# Altium project APE - Single Board Computer.PrjPcb (part 3 of 3)

## Sheet 13_Wireless.SchDoc
size 812 x 508 mm; SheetNumber: 13; SheetTotal: 16
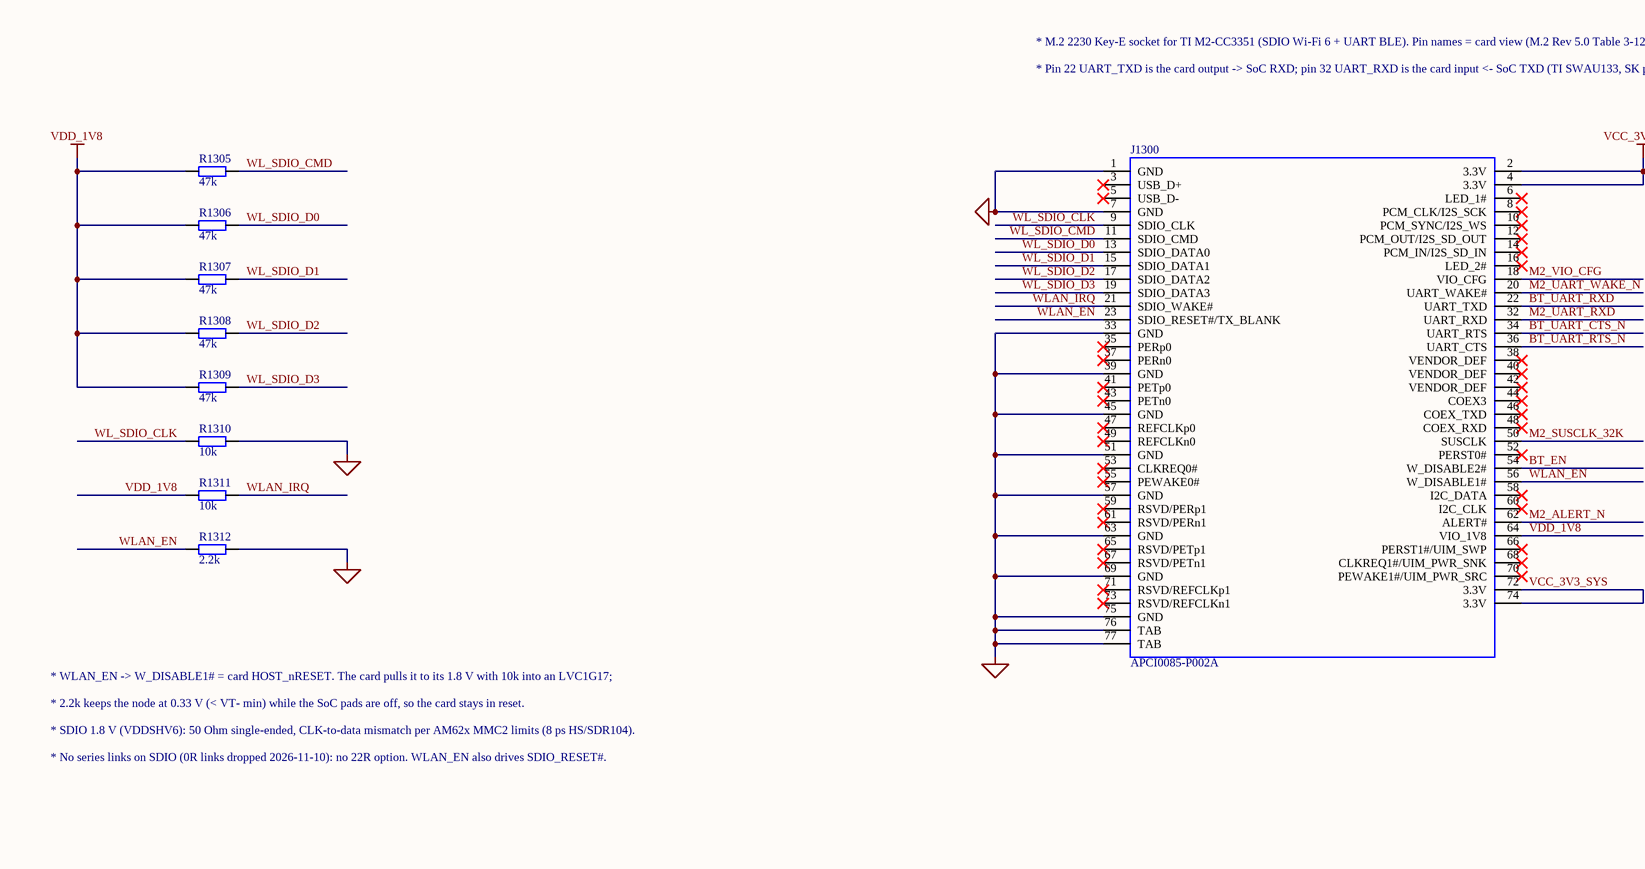
[diagram p17: 13_Wireless.SchDoc, left]
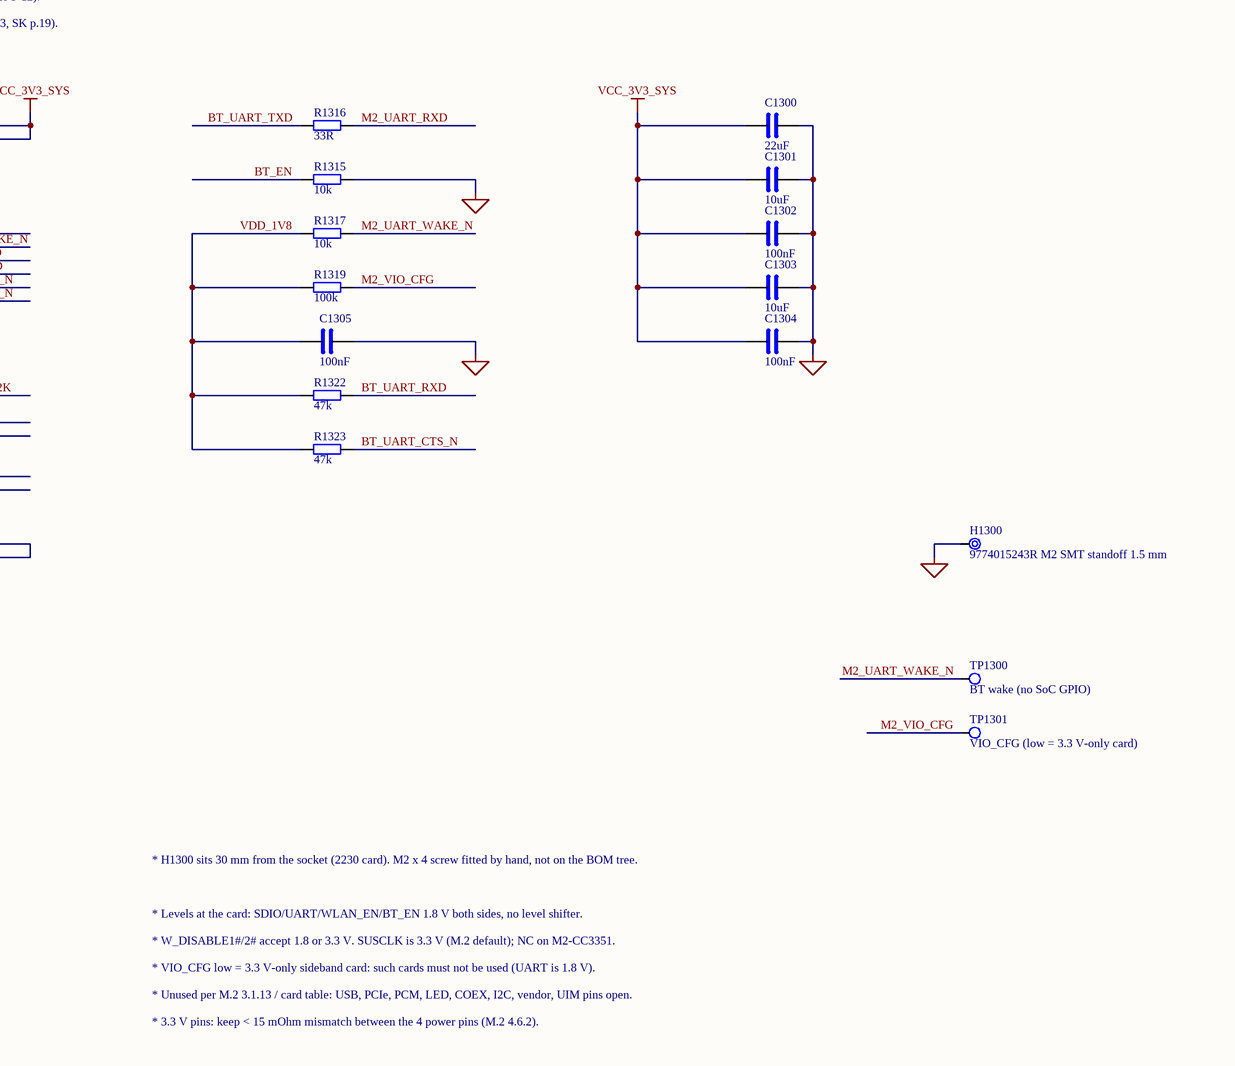
[diagram p18: 13_Wireless.SchDoc, right]

### Parts
C1300  22uF  [C0805]
C1301  10uF  [C0603]
C1302  100nF  [C0402]
C1303  10uF  [C0603]
C1304  100nF  [C0402]
C1305  100nF  [C0402]
H1300  9774015243R M2 SMT standoff 1.5 mm  [STANDOFF_WE_9774015243R]
J1300  APCI0085-P002A  [M2_KEYE_APCI0085]
R1305  47k  [R0402]
R1306  47k  [R0402]
R1307  47k  [R0402]
R1308  47k  [R0402]
R1309  47k  [R0402]
R1310  10k  [R0402]
R1311  10k  [R0402]
R1312  2.2k  [R0402]
R1315  10k  [R0402]
R1316  33R  [R0402]
R1317  10k  [R0402]
R1319  100k  [R0402]
R1322  47k  [R0402]
R1323  47k  [R0402]
TP1300  BT wake (no SoC GPIO)  [TP_PAD_1.0]
TP1301  VIO_CFG (low = 3.3 V-only card)  [TP_PAD_1.0]

### Nets
GND: C1300.2 C1301.2 C1302.2 C1303.2 C1304.2 C1305.2 H1300.1(MH) J1300.1(GND) J1300.7(GND) J1300.33(GND) J1300.39(GND) J1300.45(GND) J1300.51(GND) J1300.57(GND) J1300.63(GND) J1300.69(GND) J1300.75(GND) J1300.76(TAB) J1300.77(TAB) R1310.2 R1312.2 R1315.2
VCC_3V3_SYS: C1300.1 C1301.1 C1302.1 C1303.1 C1304.1 J1300.2(3.3V) J1300.4(3.3V) J1300.72(3.3V) J1300.74(3.3V)
VDD_1V8: C1305.1 J1300.64(VIO_1V8) R1305.1 R1306.1 R1307.1 R1308.1 R1309.1 R1311.1 R1317.1 R1319.1 R1322.1 R1323.1
BT_EN: J1300.54(W_DISABLE2#) R1315.1
BT_UART_CTS_N: J1300.34(UART_RTS) R1323.2
BT_UART_RTS_N: J1300.36(UART_CTS)
BT_UART_RXD: J1300.22(UART_TXD) R1322.2
BT_UART_TXD: R1316.1
M2_ALERT_N: J1300.62(ALERT#)
M2_SUSCLK_32K: J1300.50(SUSCLK)
M2_UART_RXD: J1300.32(UART_RXD) R1316.2
M2_UART_WAKE_N: J1300.20(UART_WAKE#) R1317.2 TP1300.1(TP)
M2_VIO_CFG: J1300.18(VIO_CFG) R1319.2 TP1301.1(TP)
WL_SDIO_CLK: J1300.9(SDIO_CLK) R1310.1
WL_SDIO_CMD: J1300.11(SDIO_CMD) R1305.2
WL_SDIO_D0: J1300.13(SDIO_DATA0) R1306.2
WL_SDIO_D1: J1300.15(SDIO_DATA1) R1307.2
WL_SDIO_D2: J1300.17(SDIO_DATA2) R1308.2
WL_SDIO_D3: J1300.19(SDIO_DATA3) R1309.2
WLAN_EN: J1300.23(SDIO_RESET#/TX_BLANK) J1300.56(W_DISABLE1#) R1312.1
WLAN_IRQ: J1300.21(SDIO_WAKE#) R1311.2

Not connected (* = marked no-connect by the designer): J1300 3(USB_D+)* 5(USB_D-)* 6(LED_1#)* 8(PCM_CLK/I2S_SCK)* 10(PCM_SYNC/I2S_WS)* 12(PCM_OUT/I2S_SD_OUT)* 14(PCM_IN/I2S_SD_IN)* 16(LED_2#)* 35(PERp0)* 37(PERn0)* 38(VENDOR_DEF)* 40(VENDOR_DEF)* 41(PETp0)* 42(VENDOR_DEF)* 43(PETn0)* 44(COEX3)* 46(COEX_TXD)* 47(REFCLKp0)* 48(COEX_RXD)* 49(REFCLKn0)* 52(PERST0#)* 53(CLKREQ0#)* 55(PEWAKE0#)* 58(I2C_DATA)* 59(RSVD/PERp1)* 60(I2C_CLK)* 61(RSVD/PERn1)* 65(RSVD/PETp1)* 66(PERST1#/UIM_SWP)* 67(RSVD/PETn1)* 68(CLKREQ1#/UIM_PWR_SNK)* 70(PEWAKE1#/UIM_PWR_SRC)* 71(RSVD/REFCLKp1)* 73(RSVD/REFCLKn1)*

### Notes on the sheet
- * M.2 2230 Key-E socket for TI M2-CC3351 (SDIO Wi-Fi 6 + UART BLE). Pin names = card view (M.2 Rev 5.0 Table 3-12).
- * Pin 22 UART_TXD is the card output -> SoC RXD; pin 32 UART_RXD is the card input <- SoC TXD (TI SWAU133, SK p.19).
- * WLAN_EN -> W_DISABLE1# = card HOST_nRESET. The card pulls it to its 1.8 V with 10k into an LVC1G17;
- * 2.2k keeps the node at 0.33 V (< VT- min) while the SoC pads are off, so the card stays in reset.
- * SDIO 1.8 V (VDDSHV6): 50 Ohm single-ended, CLK-to-data mismatch per AM62x MMC2 limits (8 ps HS/SDR104).
- * No series links on SDIO (0R links dropped 2026-11-10): no 22R option. WLAN_EN also drives SDIO_RESET#.
- * H1300 sits 30 mm from the socket (2230 card). M2 x 4 screw fitted by hand, not on the BOM tree.
- * Levels at the card: SDIO/UART/WLAN_EN/BT_EN 1.8 V both sides, no level shifter.
- * W_DISABLE1#/2# accept 1.8 or 3.3 V. SUSCLK is 3.3 V (M.2 default); NC on M2-CC3351.
- * VIO_CFG low = 3.3 V-only sideband card: such cards must not be used (UART is 1.8 V).
- * Unused per M.2 3.1.13 / card table: USB, PCIe, PCM, LED, COEX, I2C, vendor, UIM pins open.
- * 3.3 V pins: keep < 15 mOhm mismatch between the 4 power pins (M.2 4.6.2).

### Library data of the parts
C1300 = CAP: Capacitor, non-polarized; MPN: CL21A226MAQNNNE; Manufacturer: Samsung; Spec: 22uF 25V X5R 0805 (bulk); LCSC: C45783
C1301 = CAP: Capacitor, non-polarized; Spec: 10uF 10V X5R 0603 (pins 2/4)
C1302 = CAP: Capacitor, non-polarized; MPN: CL05B104KO5NNNC; Manufacturer: Samsung; Spec: 100nF 16V X7R 0402 (pins 2/4); LCSC: C1525
C1303 = CAP: Capacitor, non-polarized; Spec: 10uF 10V X5R 0603 (pins 72/74)
C1304 = CAP: Capacitor, non-polarized; MPN: CL05B104KO5NNNC; Manufacturer: Samsung; Spec: 100nF 16V X7R 0402 (pins 72/74); LCSC: C1525
C1305 = CAP: Capacitor, non-polarized; MPN: CL05B104KO5NNNC; Manufacturer: Samsung; Spec: 100nF 16V X7R 0402 (pin 64); LCSC: C1525
H1300 = MOUNTING_HOLE: Plated mounting hole (pin to GND); Manufacturer: Wurth Elektronik; MPN: 9774015243R; LCSC: C22431324
J1300 = APCI0085-P002A: M.2 Key-E socket, 67 contacts 0.5 mm, H3.2, 2 SMT tabs (LOTES APCI0085-P002A); MPN: APCI0085-P002A; Manufacturer: LOTES; LCSC: C841649
R1305-R1309 = RES: Resistor; MPN: 0402WGF4702TCE; Manufacturer: UNI-ROYAL; Spec: 47k 0402 (SDIO pull-up); LCSC: C25792
R1310 = RES: Resistor; MPN: 0402WGF1002TCE; Manufacturer: UNI-ROYAL; Spec: 10k 0402 (SK R12, clock low while pad is off); LCSC: C25744
R1311 = RES: Resistor; MPN: 0402WGF1002TCE; Manufacturer: UNI-ROYAL; Spec: 10k 0402 (card IRQ is open drain, SK R6); LCSC: C25744
R1312 = RES: Resistor; Spec: 2.2k 0402 (beats the card's 10k pull-up: 0.33 V)
R1315 = RES: Resistor; MPN: 0402WGF1002TCE; Manufacturer: UNI-ROYAL; Spec: 10k 0402 (W_DISABLE2#: BT off by default); LCSC: C25744
R1316 = RES: Resistor; Spec: 33R 0402 (SK R24)
R1317 = RES: Resistor; MPN: 0402WGF1002TCE; Manufacturer: UNI-ROYAL; Spec: 10k 0402 (card IRQ_BLE open drain); LCSC: C25744
R1319 = RES: Resistor; Spec: 100k 0402 (VIO_CFG weak pull-up, M.2 3.1.15)
R1322 = RES: Resistor; MPN: 0402WGF4702TCE; Manufacturer: UNI-ROYAL; Spec: 47k 0402 (UART6 RXD pull-up, 62_UART_2); LCSC: C25792
R1323 = RES: Resistor; MPN: 0402WGF4702TCE; Manufacturer: UNI-ROYAL; Spec: 47k 0402 (UART6 CTSn pull-up); LCSC: C25792
TP1300 TP1301 = TESTPOINT: Test point

## Sheet 14_Expansion.SchDoc
size 812 x 508 mm; SheetNumber: 14; SheetTotal: 16
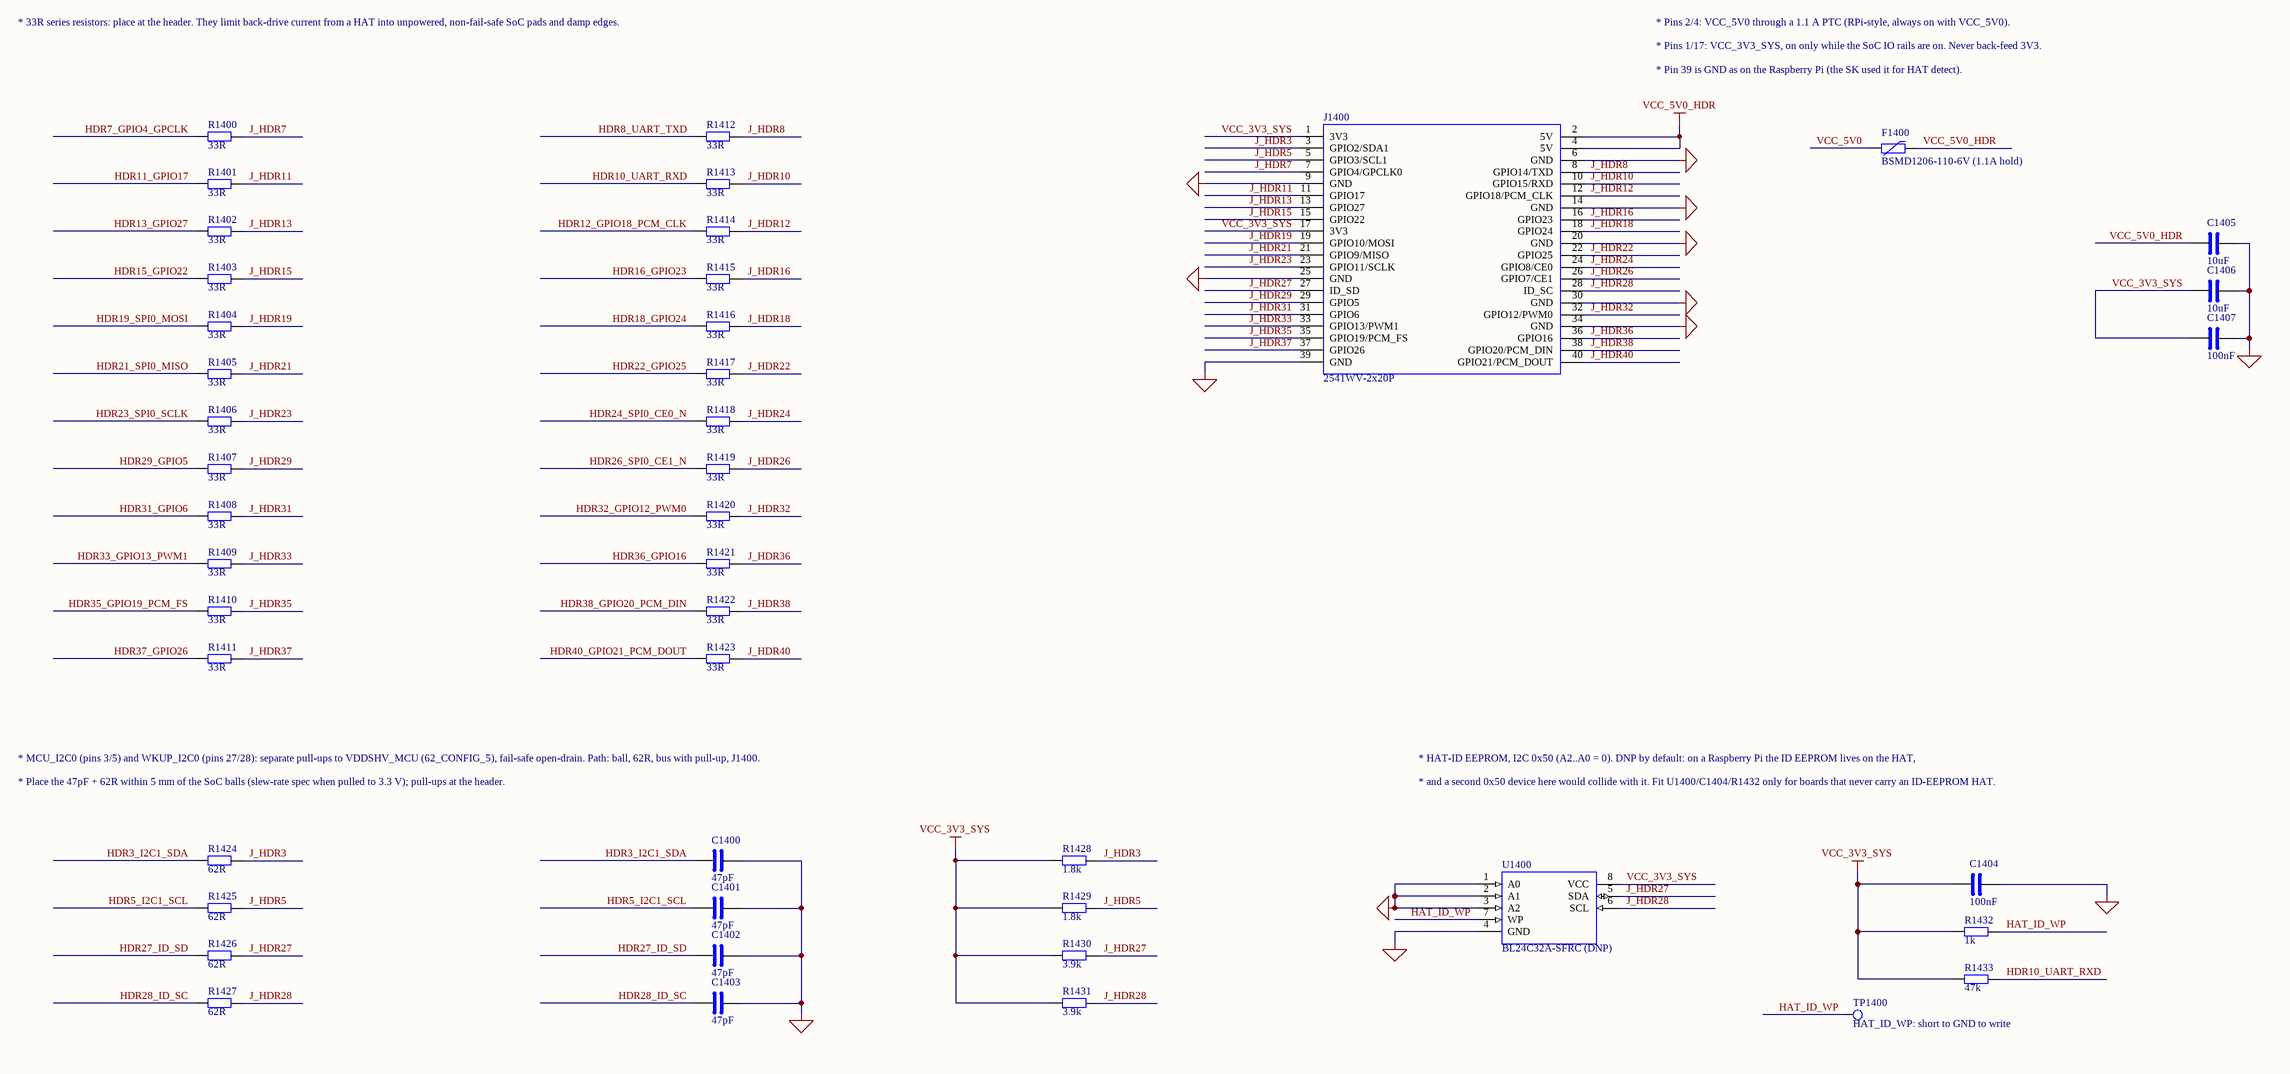
[diagram p19: 14_Expansion.SchDoc]

### Parts
C1400  47pF  [C0402]
C1401  47pF  [C0402]
C1402  47pF  [C0402]
C1403  47pF  [C0402]
C1404  100nF  [C0402]
C1405  10uF  [C0603]
C1406  10uF  [C0603]
C1407  100nF  [C0402]
F1400  BSMD1206-110-6V (1.1A hold)  [FUSE_BHFUSE_BSMD1206]
J1400  2541WV-2x20P  [HDR_2X20_P2.54_THT]
R1400  33R  [R0402]
R1401  33R  [R0402]
R1402  33R  [R0402]
R1403  33R  [R0402]
R1404  33R  [R0402]
R1405  33R  [R0402]
R1406  33R  [R0402]
R1407  33R  [R0402]
R1408  33R  [R0402]
R1409  33R  [R0402]
R1410  33R  [R0402]
R1411  33R  [R0402]
R1412  33R  [R0402]
R1413  33R  [R0402]
R1414  33R  [R0402]
R1415  33R  [R0402]
R1416  33R  [R0402]
R1417  33R  [R0402]
R1418  33R  [R0402]
R1419  33R  [R0402]
R1420  33R  [R0402]
R1421  33R  [R0402]
R1422  33R  [R0402]
R1423  33R  [R0402]
R1424  62R  [R0402]
R1425  62R  [R0402]
R1426  62R  [R0402]
R1427  62R  [R0402]
R1428  1.8k  [R0402]
R1429  1.8k  [R0402]
R1430  3.9k  [R0402]
R1431  3.9k  [R0402]
R1432  1k  [R0402]
R1433  47k  [R0402]
TP1400  HAT_ID_WP: short to GND to write  [TP_PAD_1.0]
U1400  BL24C32A-SFRC (DNP)  [TSSOP8_4.4X3.0_P0.65]

### Nets
GND: C1400.2 C1401.2 C1402.2 C1403.2 C1404.2 C1405.2 C1406.2 C1407.2 J1400.6(GND) J1400.9(GND) J1400.14(GND) J1400.20(GND) J1400.25(GND) J1400.30(GND) J1400.34(GND) J1400.39(GND) U1400.1(A0) U1400.2(A1) U1400.3(A2) U1400.4(GND)
VCC_3V3_SYS: C1404.1 C1406.1 C1407.1 J1400.1(3V3) J1400.17(3V3) R1428.1 R1429.1 R1430.1 R1431.1 R1432.1 R1433.1 U1400.8(VCC)
VCC_5V0: F1400.1
VCC_5V0_HDR: C1405.1 F1400.2 J1400.2(5V) J1400.4(5V)
HAT_ID_WP: R1432.2 TP1400.1(TP) U1400.7(WP)
HDR3_I2C1_SDA: C1400.1 R1424.1
HDR5_I2C1_SCL: C1401.1 R1425.1
HDR7_GPIO4_GPCLK: R1400.1
HDR8_UART_TXD: R1412.1
HDR10_UART_RXD: R1413.1 R1433.2
HDR11_GPIO17: R1401.1
HDR12_GPIO18_PCM_CLK: R1414.1
HDR13_GPIO27: R1402.1
HDR15_GPIO22: R1403.1
HDR16_GPIO23: R1415.1
HDR18_GPIO24: R1416.1
HDR19_SPI0_MOSI: R1404.1
HDR21_SPI0_MISO: R1405.1
HDR22_GPIO25: R1417.1
HDR23_SPI0_SCLK: R1406.1
HDR24_SPI0_CE0_N: R1418.1
HDR26_SPI0_CE1_N: R1419.1
HDR27_ID_SD: C1402.1 R1426.1
HDR28_ID_SC: C1403.1 R1427.1
HDR29_GPIO5: R1407.1
HDR31_GPIO6: R1408.1
HDR32_GPIO12_PWM0: R1420.1
HDR33_GPIO13_PWM1: R1409.1
HDR35_GPIO19_PCM_FS: R1410.1
HDR36_GPIO16: R1421.1
HDR37_GPIO26: R1411.1
HDR38_GPIO20_PCM_DIN: R1422.1
HDR40_GPIO21_PCM_DOUT: R1423.1
J_HDR3: J1400.3(GPIO2/SDA1) R1424.2 R1428.2
J_HDR5: J1400.5(GPIO3/SCL1) R1425.2 R1429.2
J_HDR7: J1400.7(GPIO4/GPCLK0) R1400.2
J_HDR8: J1400.8(GPIO14/TXD) R1412.2
J_HDR10: J1400.10(GPIO15/RXD) R1413.2
J_HDR11: J1400.11(GPIO17) R1401.2
J_HDR12: J1400.12(GPIO18/PCM_CLK) R1414.2
J_HDR13: J1400.13(GPIO27) R1402.2
J_HDR15: J1400.15(GPIO22) R1403.2
J_HDR16: J1400.16(GPIO23) R1415.2
J_HDR18: J1400.18(GPIO24) R1416.2
J_HDR19: J1400.19(GPIO10/MOSI) R1404.2
J_HDR21: J1400.21(GPIO9/MISO) R1405.2
J_HDR22: J1400.22(GPIO25) R1417.2
J_HDR23: J1400.23(GPIO11/SCLK) R1406.2
J_HDR24: J1400.24(GPIO8/CE0) R1418.2
J_HDR26: J1400.26(GPIO7/CE1) R1419.2
J_HDR27: J1400.27(ID_SD) R1426.2 R1430.2 U1400.5(SDA)
J_HDR28: J1400.28(ID_SC) R1427.2 R1431.2 U1400.6(SCL)
J_HDR29: J1400.29(GPIO5) R1407.2
J_HDR31: J1400.31(GPIO6) R1408.2
J_HDR32: J1400.32(GPIO12/PWM0) R1420.2
J_HDR33: J1400.33(GPIO13/PWM1) R1409.2
J_HDR35: J1400.35(GPIO19/PCM_FS) R1410.2
J_HDR36: J1400.36(GPIO16) R1421.2
J_HDR37: J1400.37(GPIO26) R1411.2
J_HDR38: J1400.38(GPIO20/PCM_DIN) R1422.2
J_HDR40: J1400.40(GPIO21/PCM_DOUT) R1423.2

### Notes on the sheet
- * 33R series resistors: place at the header. They limit back-drive current from a HAT into unpowered, non-fail-safe SoC pads and damp edges.
- * Pins 2/4: VCC_5V0 through a 1.1 A PTC (RPi-style, always on with VCC_5V0).
- * Pins 1/17: VCC_3V3_SYS, on only while the SoC IO rails are on. Never back-feed 3V3.
- * Pin 39 is GND as on the Raspberry Pi (the SK used it for HAT detect).
- * MCU_I2C0 (pins 3/5) and WKUP_I2C0 (pins 27/28): separate pull-ups to VDDSHV_MCU (62_CONFIG_5), fail-safe open-drain. Path: ball, 62R, bus with pull-up, J1400.
- * HAT-ID EEPROM, I2C 0x50 (A2..A0 = 0). DNP by default: on a Raspberry Pi the ID EEPROM lives on the HAT,
- * Place the 47pF + 62R within 5 mm of the SoC balls (slew-rate spec when pulled to 3.3 V); pull-ups at the header.
- * and a second 0x50 device here would collide with it. Fit U1400/C1404/R1432 only for boards that never carry an ID-EEPROM HAT.

### Library data of the parts
C1400-C1403 = CAP: Capacitor, non-polarized; MPN: 0402CG470J500NT; Manufacturer: FH; Spec: 47pF 50V C0G 0402 (I2C slew limiter)
C1404 = CAP: Capacitor, non-polarized; DNP: 1; Spec: 100nF 16V X7R 0402 (EEPROM, DNP)
C1405 = CAP: Capacitor, non-polarized; Spec: 10uF 10V X5R 0603 (header 5V)
C1406 = CAP: Capacitor, non-polarized; Spec: 10uF 10V X5R 0603 (header 3V3)
C1407 = CAP: Capacitor, non-polarized; Spec: 100nF 16V X7R 0402 (header 3V3)
F1400 = PTC_BSMD1206: PTC resettable fuse, 1206, not polarized; Manufacturer: BHFUSE; MPN: BSMD1206-110-6V
J1400 = HDR_2X20_2541WV: Pin header 2x20 2.54 mm, Raspberry Pi 40-pin numbering; Manufacturer: HanElectricity; MPN: 2541WV-2x20P
R1400-R1423 = RES: Resistor; MPN: 0402WGF330JTCE; Manufacturer: UNI-ROYAL; Spec: 33R 1% 0402
R1424-R1427 = RES: Resistor; MPN: 0402WGF620JTCE; Manufacturer: UNI-ROYAL; Spec: 62R 1% 0402 (slew limiter)
R1428 R1429 = RES: Resistor; Spec: 1.8k 1% 0402 (RPi I2C1 value)
R1430 R1431 = RES: Resistor; Spec: 3.9k 1% 0402 (HAT ID bus)
R1432 = RES: Resistor; DNP: 1; Spec: 1k 1% 0402 (WP pull-up, DNP)
R1433 = RES: Resistor; Spec: 47k 1% 0402 (UART5 RX idle high, Octavo 62_UART_2)
TP1400 = TESTPOINT: Test point
U1400 = BL24C32A_TSSOP8: BL24C32A 32 Kbit I2C EEPROM (2-byte address), TSSOP-8; Manufacturer: Shanghai Belling; DNP: 1; MPN: BL24C32A-SFRC

## Sheet 15_Debug.SchDoc
size 812 x 508 mm; SheetNumber: 15; SheetTotal: 16
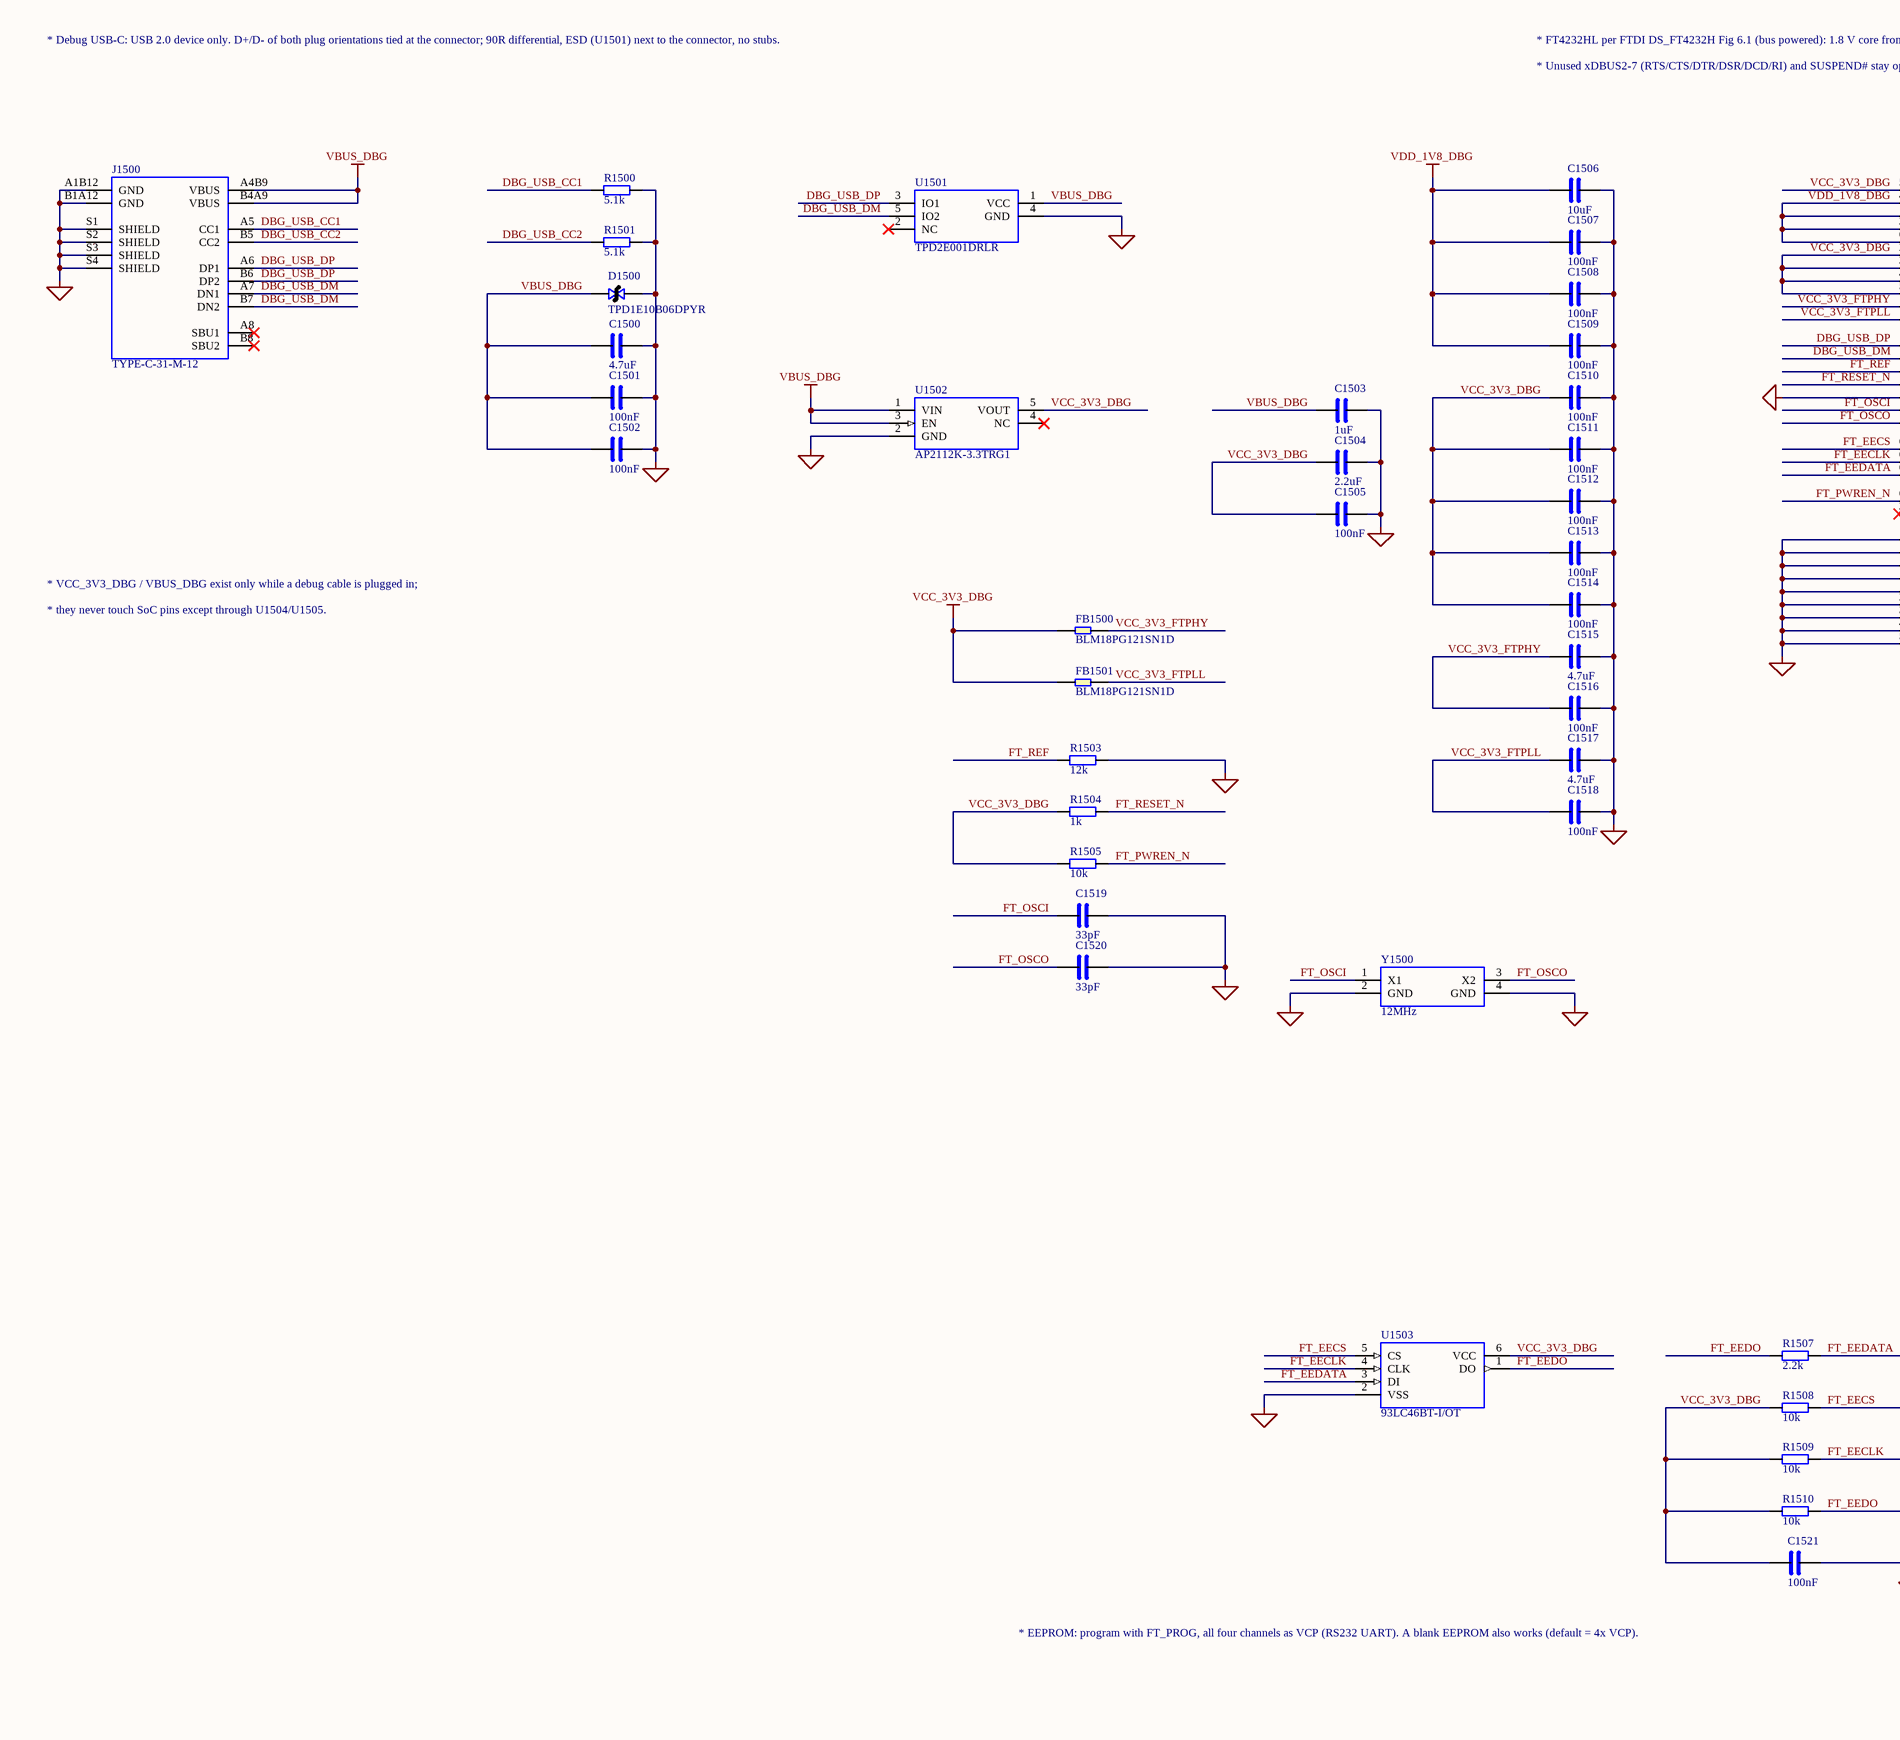
[diagram p20: 15_Debug.SchDoc, left]
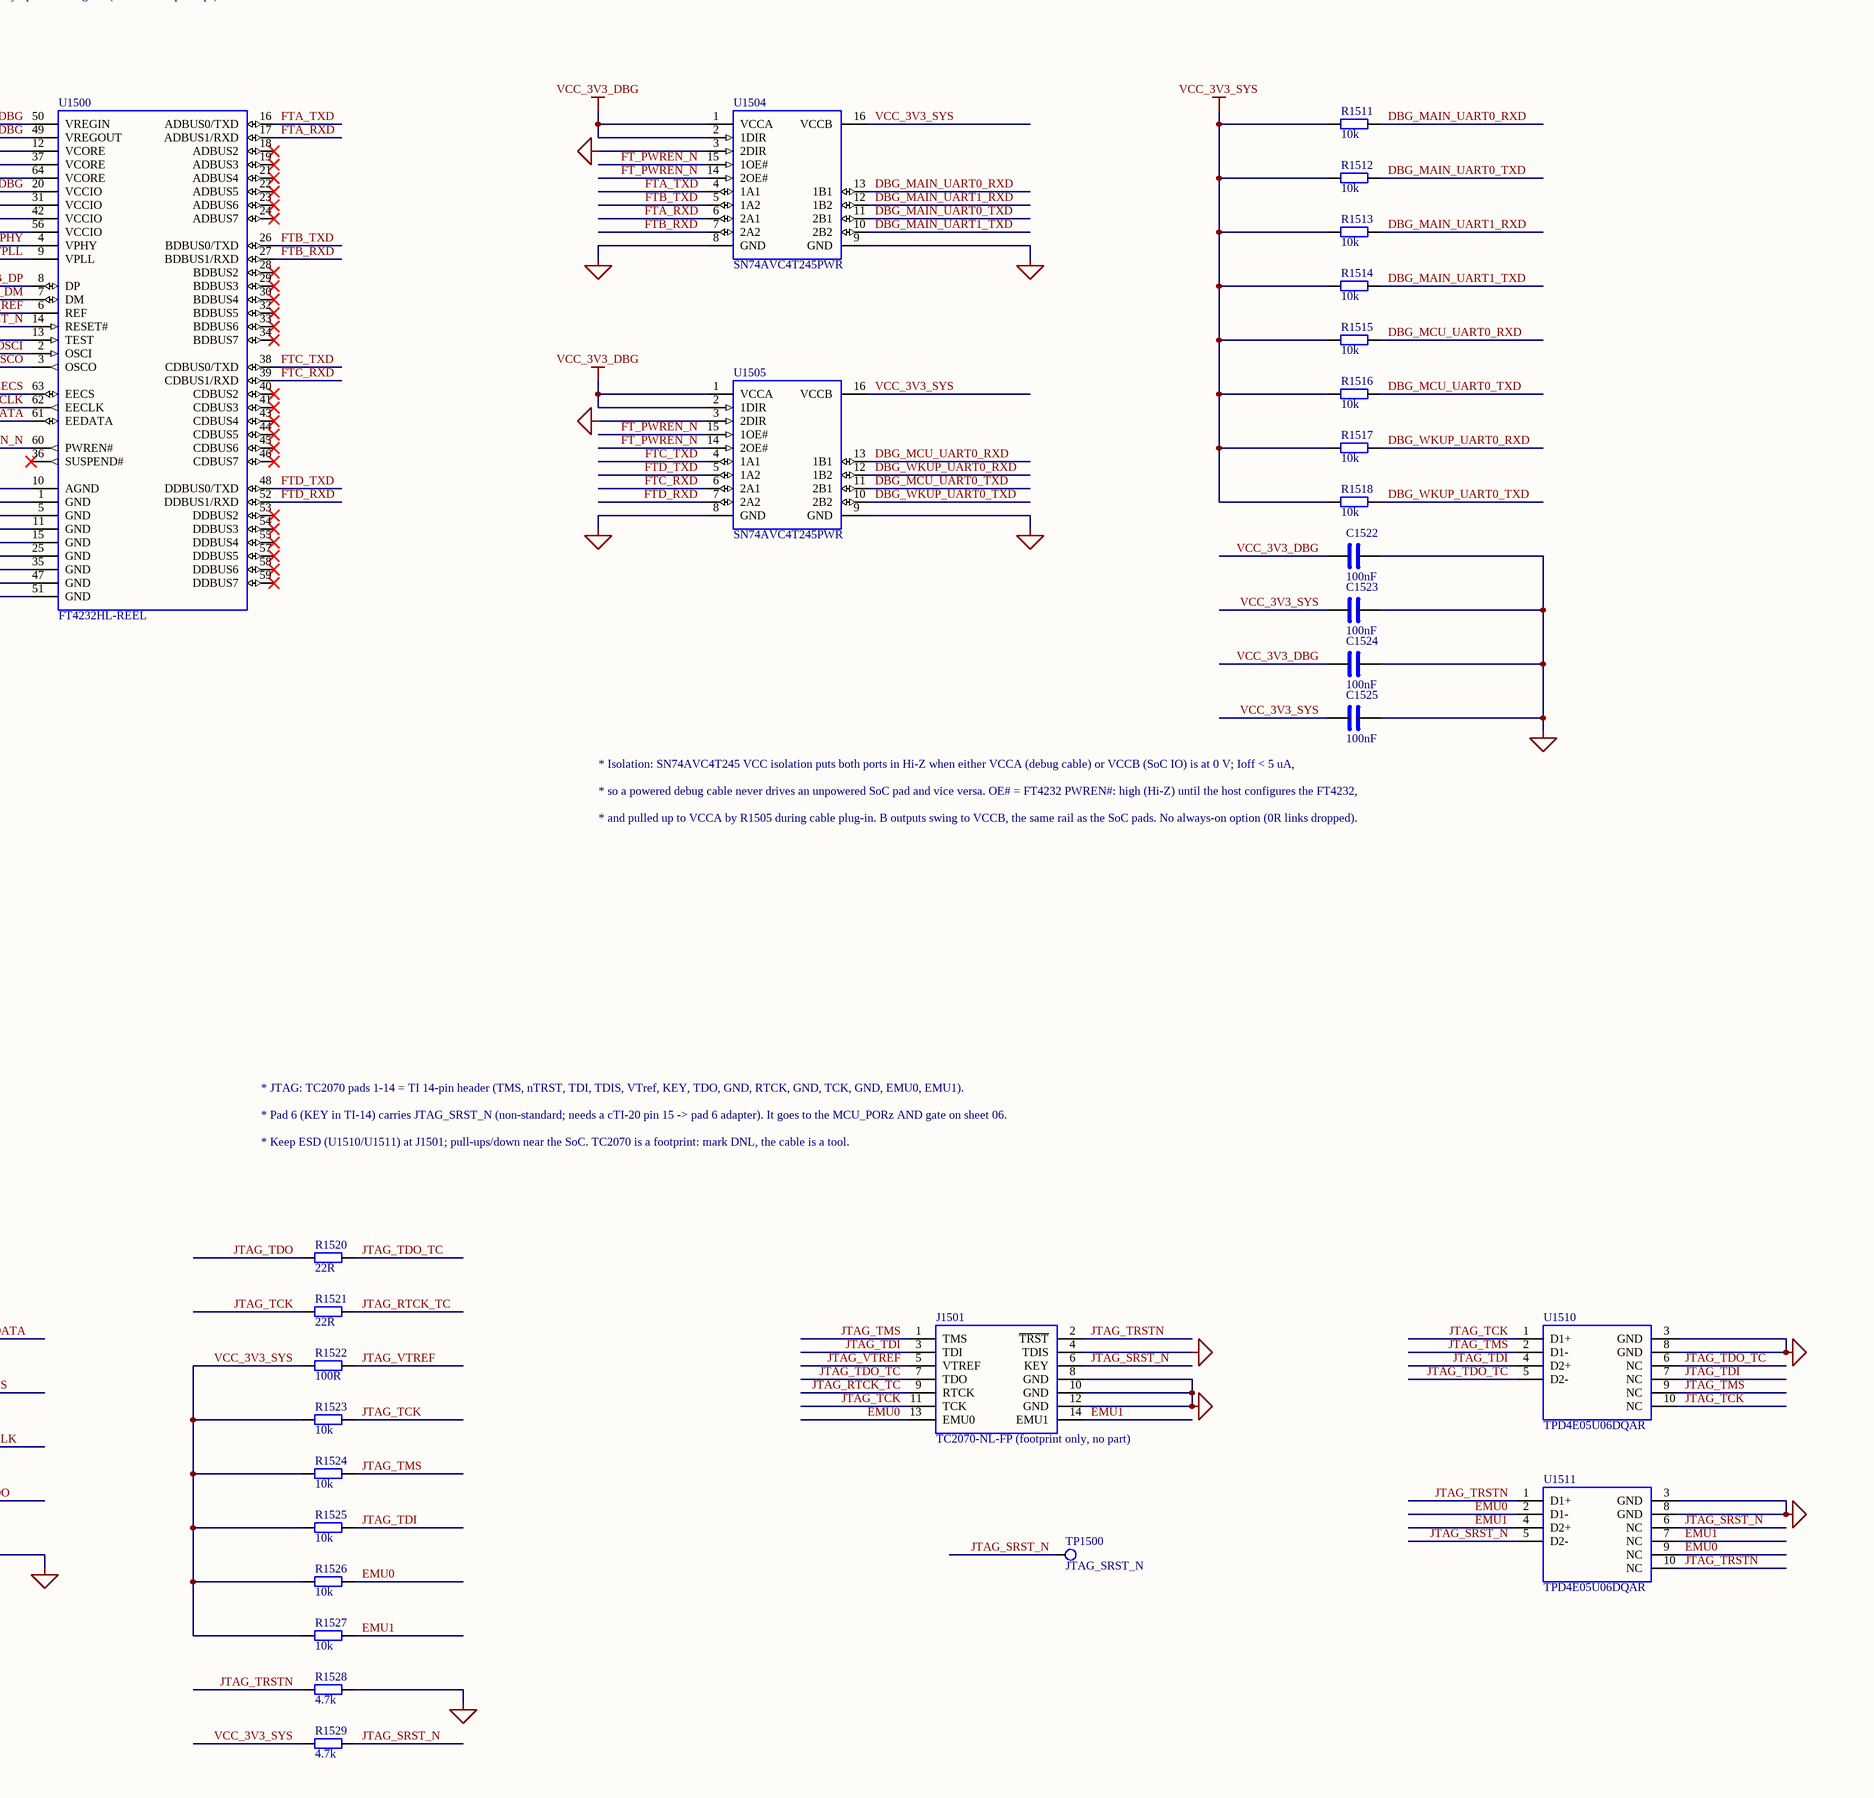
[diagram p21: 15_Debug.SchDoc, right]

### Parts
C1500  4.7uF  [C0603]
C1501  100nF  [C0402]
C1502  100nF  [C0402]
C1503  1uF  [C0402]
C1504  2.2uF  [C0402]
C1505  100nF  [C0402]
C1506  10uF  [C0603]
C1507  100nF  [C0402]
C1508  100nF  [C0402]
C1509  100nF  [C0402]
C1510  100nF  [C0402]
C1511  100nF  [C0402]
C1512  100nF  [C0402]
C1513  100nF  [C0402]
C1514  100nF  [C0402]
C1515  4.7uF  [C0402]
C1516  100nF  [C0402]
C1517  4.7uF  [C0402]
C1518  100nF  [C0402]
C1519  33pF  [C0402]
C1520  33pF  [C0402]
C1521  100nF  [C0402]
C1522  100nF  [C0402]
C1523  100nF  [C0402]
C1524  100nF  [C0402]
C1525  100nF  [C0402]
D1500  TPD1E10B06DPYR  [X1SON2_DPY]
FB1500  BLM18PG121SN1D  [FB0603]
FB1501  BLM18PG121SN1D  [FB0603]
J1500  TYPE-C-31-M-12  [USB-C_HRO_TYPE-C-31-M-12]
J1501  TC2070-NL-FP (footprint only, no part)  [TC2070-NL]
R1500  5.1k  [R0402]
R1501  5.1k  [R0402]
R1503  12k  [R0402]
R1504  1k  [R0402]
R1505  10k  [R0402]
R1507  2.2k  [R0402]
R1508  10k  [R0402]
R1509  10k  [R0402]
R1510  10k  [R0402]
R1511  10k  [R0402]
R1512  10k  [R0402]
R1513  10k  [R0402]
R1514  10k  [R0402]
R1515  10k  [R0402]
R1516  10k  [R0402]
R1517  10k  [R0402]
R1518  10k  [R0402]
R1520  22R  [R0402]
R1521  22R  [R0402]
R1522  100R  [R0402]
R1523  10k  [R0402]
R1524  10k  [R0402]
R1525  10k  [R0402]
R1526  10k  [R0402]
R1527  10k  [R0402]
R1528  4.7k  [R0402]
R1529  4.7k  [R0402]
TP1500  JTAG_SRST_N  [TP_PAD_1.0]
U1500  FT4232HL-REEL  [LQFP64_10X10_P0.5]
U1501  TPD2E001DRLR  [SOT553-5]
U1502  AP2112K-3.3TRG1  [SOT23-5]
U1503  93LC46BT-I/OT  [SOT23-6]
U1504  SN74AVC4T245PWR  [TSSOP16_4.4X5.0_P0.65]
U1505  SN74AVC4T245PWR  [TSSOP16_4.4X5.0_P0.65]
U1510  TPD4E05U06DQAR  [USON10_DQA]
U1511  TPD4E05U06DQAR  [USON10_DQA]
Y1500  12MHz  [XTAL_3225_4P]

### Nets
GND: C1500.2 C1501.2 C1502.2 C1503.2 C1504.2 C1505.2 C1506.2 C1507.2 C1508.2 C1509.2 C1510.2 C1511.2 C1512.2 C1513.2 C1514.2 C1515.2 C1516.2 C1517.2 C1518.2 C1519.2 C1520.2 C1521.2 C1522.2 C1523.2 C1524.2 C1525.2 D1500.2 J1500.A1B12(GND) J1500.B1A12(GND) J1500.S1(SHIELD) J1500.S2(SHIELD) J1500.S3(SHIELD) J1500.S4(SHIELD) J1501.4(TDIS) J1501.8(GND) J1501.10(GND) J1501.12(GND) R1500.2 R1501.2 R1503.2 R1528.2 U1500.1(GND) U1500.5(GND) U1500.10(AGND) U1500.11(GND) U1500.13(TEST) U1500.15(GND) U1500.25(GND) U1500.35(GND) U1500.47(GND) U1500.51(GND) U1501.4(GND) U1502.2(GND) U1503.2(VSS) U1504.3(2DIR) U1504.8(GND) U1504.9(GND) U1505.3(2DIR) U1505.8(GND) U1505.9(GND) U1510.3(GND) U1510.8(GND) U1511.3(GND) U1511.8(GND) Y1500.2(GND) Y1500.4(GND)
VBUS_DBG: C1500.1 C1501.1 C1502.1 C1503.1 D1500.1 J1500.A4B9(VBUS) J1500.B4A9(VBUS) U1501.1(VCC) U1502.1(VIN) U1502.3(EN)
VCC_3V3_DBG: C1504.1 C1505.1 C1510.1 C1511.1 C1512.1 C1513.1 C1514.1 C1521.1 C1522.1 C1524.1 FB1500.1 FB1501.1 R1504.1 R1505.1 R1508.1 R1509.1 R1510.1 U1500.20(VCCIO) U1500.31(VCCIO) U1500.42(VCCIO) U1500.50(VREGIN) U1500.56(VCCIO) U1502.5(VOUT) U1503.6(VCC) U1504.1(VCCA) U1504.2(1DIR) U1505.1(VCCA) U1505.2(1DIR)
VCC_3V3_SYS: C1523.1 C1525.1 R1511.1 R1512.1 R1513.1 R1514.1 R1515.1 R1516.1 R1517.1 R1518.1 R1522.1 R1523.1 R1524.1 R1525.1 R1526.1 R1527.1 R1529.1 U1504.16(VCCB) U1505.16(VCCB)
VDD_1V8_DBG: C1506.1 C1507.1 C1508.1 C1509.1 U1500.12(VCORE) U1500.37(VCORE) U1500.49(VREGOUT) U1500.64(VCORE)
DBG_MAIN_UART0_RXD: R1511.2 U1504.13(1B1)
DBG_MAIN_UART0_TXD: R1512.2 U1504.11(2B1)
DBG_MAIN_UART1_RXD: R1513.2 U1504.12(1B2)
DBG_MAIN_UART1_TXD: R1514.2 U1504.10(2B2)
DBG_MCU_UART0_RXD: R1515.2 U1505.13(1B1)
DBG_MCU_UART0_TXD: R1516.2 U1505.11(2B1)
DBG_USB_CC1: J1500.A5(CC1) R1500.1
DBG_USB_CC2: J1500.B5(CC2) R1501.1
DBG_USB_DM: J1500.A7(DN1) J1500.B7(DN2) U1500.7(DM) U1501.5(IO2)
DBG_USB_DP: J1500.A6(DP1) J1500.B6(DP2) U1500.8(DP) U1501.3(IO1)
DBG_WKUP_UART0_RXD: R1517.2 U1505.12(1B2)
DBG_WKUP_UART0_TXD: R1518.2 U1505.10(2B2)
EMU0: J1501.13(EMU0) R1526.2 U1511.2(D1-) U1511.9(NC)
EMU1: J1501.14(EMU1) R1527.2 U1511.4(D2+) U1511.7(NC)
FT_EECLK: R1509.2 U1500.62(EECLK) U1503.4(CLK)
FT_EECS: R1508.2 U1500.63(EECS) U1503.5(CS)
FT_EEDATA: R1507.2 U1500.61(EEDATA) U1503.3(DI)
FT_EEDO: R1507.1 R1510.2 U1503.1(DO)
FT_OSCI: C1519.1 U1500.2(OSCI) Y1500.1(X1)
FT_OSCO: C1520.1 U1500.3(OSCO) Y1500.3(X2)
FT_PWREN_N: R1505.2 U1500.60(PWREN#) U1504.14(2OE#) U1504.15(1OE#) U1505.14(2OE#) U1505.15(1OE#)
FT_REF: R1503.1 U1500.6(REF)
FT_RESET_N: R1504.2 U1500.14(RESET#)
FTA_RXD: U1500.17(ADBUS1/RXD) U1504.6(2A1)
FTA_TXD: U1500.16(ADBUS0/TXD) U1504.4(1A1)
FTB_RXD: U1500.27(BDBUS1/RXD) U1504.7(2A2)
FTB_TXD: U1500.26(BDBUS0/TXD) U1504.5(1A2)
FTC_RXD: U1500.39(CDBUS1/RXD) U1505.6(2A1)
FTC_TXD: U1500.38(CDBUS0/TXD) U1505.4(1A1)
FTD_RXD: U1500.52(DDBUS1/RXD) U1505.7(2A2)
FTD_TXD: U1500.48(DDBUS0/TXD) U1505.5(1A2)
JTAG_RTCK_TC: J1501.9(RTCK) R1521.2
JTAG_SRST_N: J1501.6(KEY) R1529.2 TP1500.1(TP) U1511.5(D2-) U1511.6(NC)
JTAG_TCK: J1501.11(TCK) R1521.1 R1523.2 U1510.1(D1+) U1510.10(NC)
JTAG_TDI: J1501.3(TDI) R1525.2 U1510.4(D2+) U1510.7(NC)
JTAG_TDO: R1520.1
JTAG_TDO_TC: J1501.7(TDO) R1520.2 U1510.5(D2-) U1510.6(NC)
JTAG_TMS: J1501.1(TMS) R1524.2 U1510.2(D1-) U1510.9(NC)
JTAG_TRSTN: J1501.2(~{TRST}) R1528.1 U1511.1(D1+) U1511.10(NC)
JTAG_VTREF: J1501.5(VTREF) R1522.2
VCC_3V3_FTPHY: C1515.1 C1516.1 FB1500.2 U1500.4(VPHY)
VCC_3V3_FTPLL: C1517.1 C1518.1 FB1501.2 U1500.9(VPLL)

Not connected (* = marked no-connect by the designer): J1500 A8(SBU1)* B8(SBU2)*; U1500 18(ADBUS2)* 19(ADBUS3)* 21(ADBUS4)* 22(ADBUS5)* 23(ADBUS6)* 24(ADBUS7)* 28(BDBUS2)* 29(BDBUS3)* 30(BDBUS4)* 32(BDBUS5)* 33(BDBUS6)* 34(BDBUS7)* 36(SUSPEND#)* 40(CDBUS2)* 41(CDBUS3)* 43(CDBUS4)* 44(CDBUS5)* 45(CDBUS6)* 46(CDBUS7)* 53(DDBUS2)* 54(DDBUS3)* 55(DDBUS4)* 57(DDBUS5)* 58(DDBUS6)* 59(DDBUS7)*; U1501 2(NC)*; U1502 4(NC)*

### Notes on the sheet
- * Debug USB-C: USB 2.0 device only. D+/D- of both plug orientations tied at the connector; 90R differential, ESD (U1501) next to the connector, no stubs.
- * FT4232HL per FTDI DS_FT4232H Fig 6.1 (bus powered): 1.8 V core from its own VREGOUT, VPHY/VPLL through 120R beads.
- * Unused xDBUS2-7 (RTS/CTS/DTR/DSR/DCD/RI) and SUSPEND# stay open as in Fig 6.1 (internal 75k pull-ups). TEST to GND.
- * VCC_3V3_DBG / VBUS_DBG exist only while a debug cable is plugged in;
- * they never touch SoC pins except through U1504/U1505.
- (near C1525) * Isolation: SN74AVC4T245 VCC isolation puts both ports in Hi-Z when either VCCA (debug cable) or VCCB (SoC IO) is at 0 V; Ioff < 5 uA,
- * so a powered debug cable never drives an unpowered SoC pad and vice versa. OE# = FT4232 PWREN#: high (Hi-Z) until the host configures the FT4232,
- * and pulled up to VCCA by R1505 during cable plug-in. B outputs swing to VCCB, the same rail as the SoC pads. No always-on option (0R links dropped).
- * JTAG: TC2070 pads 1-14 = TI 14-pin header (TMS, nTRST, TDI, TDIS, VTref, KEY, TDO, GND, RTCK, GND, TCK, GND, EMU0, EMU1).
- * Pad 6 (KEY in TI-14) carries JTAG_SRST_N (non-standard; needs a cTI-20 pin 15 -> pad 6 adapter). It goes to the MCU_PORz AND gate on sheet 06.
- * Keep ESD (U1510/U1511) at J1501; pull-ups/down near the SoC. TC2070 is a footprint: mark DNL, the cable is a tool.
- * EEPROM: program with FT_PROG, all four channels as VCP (RS232 UART). A blank EEPROM also works (default = 4x VCP).

### Library data of the parts
C1500 = CAP: Capacitor, non-polarized; Spec: 4.7uF 10V X5R 0603 (VBUS; total <= 10uF)
C1501 = CAP: Capacitor, non-polarized; Spec: 100nF 16V X7R 0402
C1502 = CAP: Capacitor, non-polarized; Spec: 100nF 16V X7R 0402 (TPD2E001 VCC)
C1503 = CAP: Capacitor, non-polarized; Spec: 1uF 10V X5R 0402 (LDO in)
C1504 = CAP: Capacitor, non-polarized; Spec: 2.2uF 10V X5R 0402 (LDO out)
C1505 = CAP: Capacitor, non-polarized; Spec: 100nF 16V X7R 0402 (LDO out)
C1506 = CAP: Capacitor, non-polarized; Spec: 10uF 10V X5R 0603 (VREGOUT, >= 3.3uF effective)
C1507 = CAP: Capacitor, non-polarized; Spec: 100nF 16V X7R 0402 (VCORE 12)
C1508 = CAP: Capacitor, non-polarized; Spec: 100nF 16V X7R 0402 (VCORE 37)
C1509 = CAP: Capacitor, non-polarized; Spec: 100nF 16V X7R 0402 (VCORE 64)
C1510 = CAP: Capacitor, non-polarized; Spec: 100nF 16V X7R 0402 (VREGIN)
C1511 = CAP: Capacitor, non-polarized; Spec: 100nF 16V X7R 0402 (VCCIO 20)
C1512 = CAP: Capacitor, non-polarized; Spec: 100nF 16V X7R 0402 (VCCIO 31)
C1513 = CAP: Capacitor, non-polarized; Spec: 100nF 16V X7R 0402 (VCCIO 42)
C1514 = CAP: Capacitor, non-polarized; Spec: 100nF 16V X7R 0402 (VCCIO 56)
C1515 = CAP: Capacitor, non-polarized; Spec: 4.7uF 10V X5R 0402 (VPHY)
C1516 = CAP: Capacitor, non-polarized; Spec: 100nF 16V X7R 0402 (VPHY)
C1517 = CAP: Capacitor, non-polarized; Spec: 4.7uF 10V X5R 0402 (VPLL)
C1518 = CAP: Capacitor, non-polarized; Spec: 100nF 16V X7R 0402 (VPLL)
C1519 C1520 = CAP: Capacitor, non-polarized; Spec: 33pF 50V C0G 0402 (CL 20pF crystal)
C1521 = CAP: Capacitor, non-polarized; Spec: 100nF 16V X7R 0402 (EEPROM)
C1522 = CAP: Capacitor, non-polarized; Spec: 100nF 16V X7R 0402 (U1504 VCCA)
C1523 = CAP: Capacitor, non-polarized; Spec: 100nF 16V X7R 0402 (U1504 VCCB)
C1524 = CAP: Capacitor, non-polarized; Spec: 100nF 16V X7R 0402 (U1505 VCCA)
C1525 = CAP: Capacitor, non-polarized; Spec: 100nF 16V X7R 0402 (U1505 VCCB)
D1500 = TVS_BI: Bidirectional TVS / ESD diode; Manufacturer: Texas Instruments; MPN: TPD1E10B06DPYR
FB1500 = FERRITE: Ferrite bead; Manufacturer: Murata; Spec: BLM18PG121SN1D 120R@100MHz (VPHY); MPN: BLM18PG121SN1D
FB1501 = FERRITE: Ferrite bead; Manufacturer: Murata; Spec: BLM18PG121SN1D 120R@100MHz (VPLL); MPN: BLM18PG121SN1D
J1500 = TYPE-C-31-M-12: USB Type-C receptacle, USB 2.0 16-contact, SMD R/A, 4 THT shell pegs; Manufacturer: Korean Hroparts (HRO); MPN: TYPE-C-31-M-12
J1501 = TC2070_TI14: Tag-Connect TC2070-NL footprint, TI 14-pin JTAG pinout (pad 6 = KEY); DNP: 1; MPN: TC2070-NL-FP; Manufacturer: Tag-Connect
R1500 R1501 = RES: Resistor; Spec: 5.1k 1% 0402 (Rd, UFP)
R1503 = RES: Resistor; Spec: 12k 1% 0402 (REF)
R1504 = RES: Resistor; Spec: 1k 1% 0402 (RESET# pull-up)
R1505 = RES: Resistor; Spec: 10k 1% 0402 (OE# pull-up)
R1507 = RES: Resistor; Spec: 2.2k 1% 0402
R1508-R1510 R1523-R1527 = RES: Resistor; Spec: 10k 1% 0402
R1511 R1513 R1515 R1517 = RES: Resistor; Spec: 10k 1% 0402 (SoC RXD pull-up)
R1512 R1514 R1516 R1518 = RES: Resistor; Spec: 10k 1% 0402 (SoC TXD pull-up)
R1520 = RES: Resistor; Spec: 22R 1% 0402 (TDO, near SoC)
R1521 = RES: Resistor; Spec: 22R 1% 0402 (RTCK loopback)
R1522 = RES: Resistor; Spec: 100R 1% 0402 (VTref current limit)
R1528 = RES: Resistor; Spec: 4.7k 1% 0402 (TRSTn pull-down)
R1529 = RES: Resistor; DNP: 1; Spec: 4.7k 0402 DNP (sheet 06 R604 already pulls SRST up)
TP1500 = TESTPOINT: Test point
U1500 = FT4232HL: FT4232H quad Hi-Speed USB to UART/MPSSE, LQFP-64; Manufacturer: FTDI; MPN: FT4232HL-REEL
U1501 = TPD2E001_DRL: 2-channel USB ESD array with VCC clamp rail, SOT-5 (DRL); Manufacturer: Texas Instruments; MPN: TPD2E001DRLR
U1502 = AP2112K_SOT25: AP2112K 600 mA CMOS LDO, fixed output, SOT-23-5; Manufacturer: Diodes Incorporated; MPN: AP2112K-3.3TRG1
U1503 = 93LC46B_OT: 93LC46B 1 Kbit Microwire EEPROM (64 x 16), SOT-23-6; Manufacturer: Microchip; MPN: 93LC46BT-I/OT
U1504 U1505 = SN74AVC4T245_PW: Dual 2-bit dual-supply bus transceiver, Ioff + VCC isolation, TSSOP-16; Manufacturer: Texas Instruments; MPN: SN74AVC4T245PWR
U1510 U1511 = TPD4E05U06_DQA: 4-channel 0.5 pF ESD array, USON-10; Manufacturer: Texas Instruments; MPN: TPD4E05U06DQAR
Y1500 = X322512MSB4SI: Crystal 3225 4-pad (1/3 crystal, 2/4 case GND); MPN: FL1200074; Manufacturer: Diodes Incorporated; Spec: 12MHz FL1200074; Supplier: Digi-Key FL1200074

## Sheet 16_Misc.SchDoc
size 508 x 381 mm; SheetNumber: 16; SheetTotal: 16
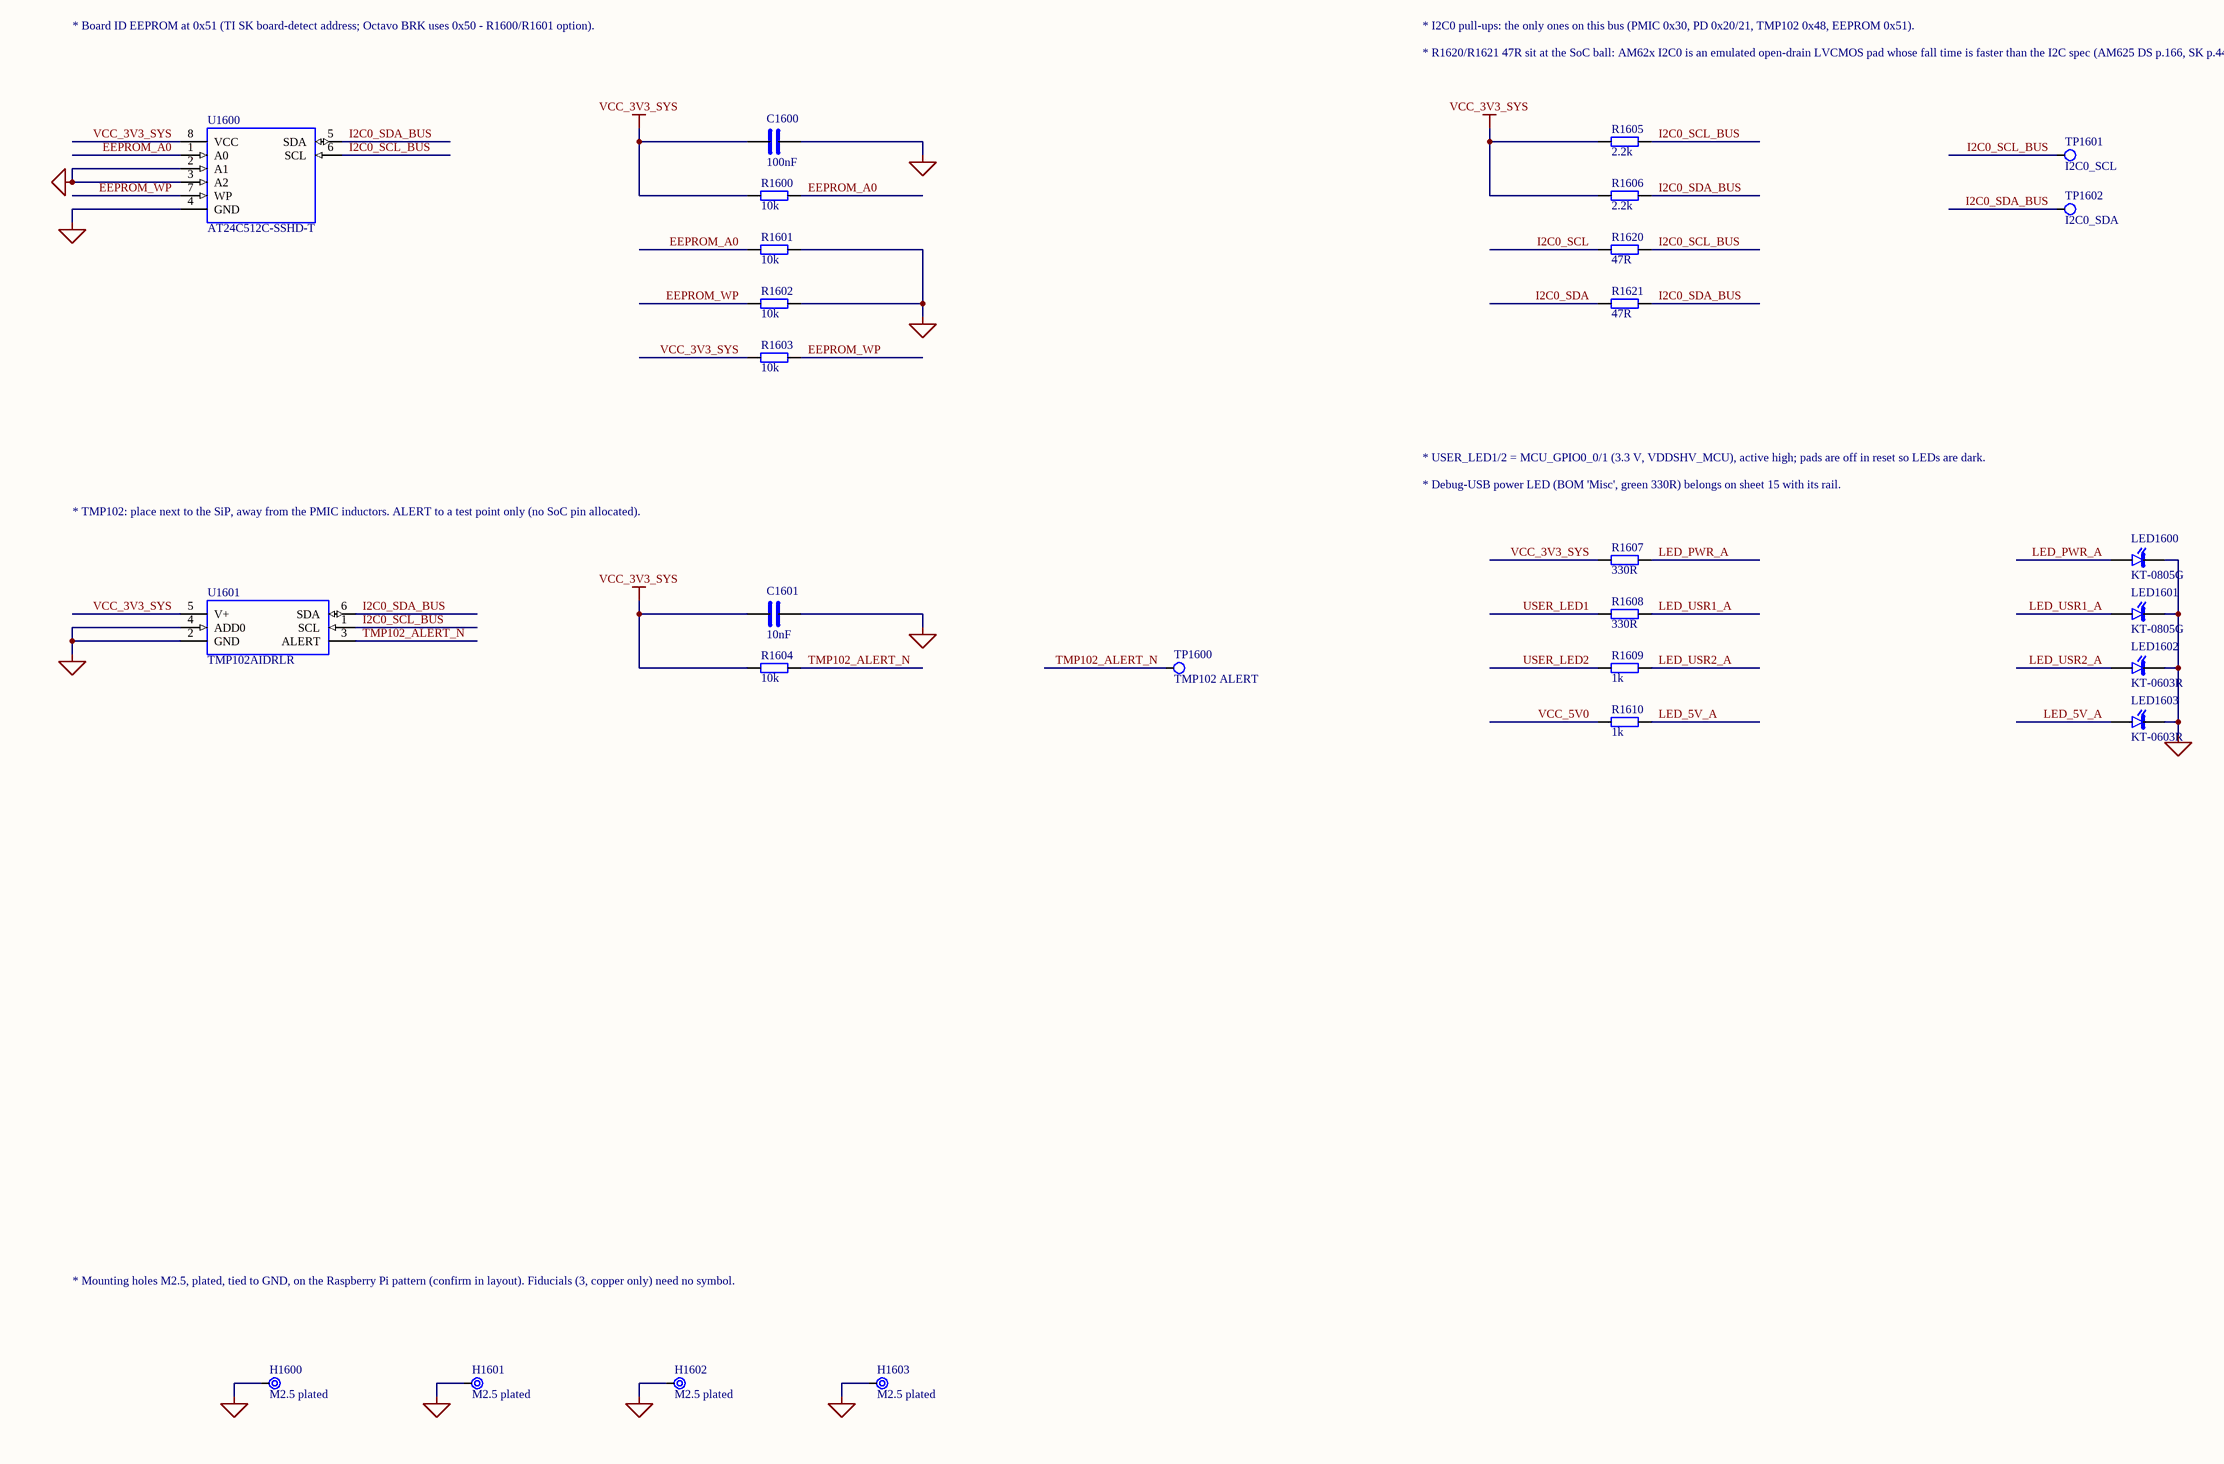
[diagram p22: 16_Misc.SchDoc]

### Parts
C1600  100nF  [C0402]
C1601  10nF  [C0402]
H1600  M2.5 plated  [MH_M2.5_PLATED]
H1601  M2.5 plated  [MH_M2.5_PLATED]
H1602  M2.5 plated  [MH_M2.5_PLATED]
H1603  M2.5 plated  [MH_M2.5_PLATED]
LED1600  KT-0805G  [LED0805]
LED1601  KT-0805G  [LED0805]
LED1602  KT-0603R  [LED0603]
LED1603  KT-0603R  [LED0603]
R1600  10k  [R0402]
R1601  10k  [R0402]
R1602  10k  [R0402]
R1603  10k  [R0402]
R1604  10k  [R0402]
R1605  2.2k  [R0402]
R1606  2.2k  [R0402]
R1607  330R  [R0402]
R1608  330R  [R0402]
R1609  1k  [R0402]
R1610  1k  [R0402]
R1620  47R  [R0402]
R1621  47R  [R0402]
TP1600  TMP102 ALERT  [TP_PAD_1.0]
TP1601  I2C0_SCL  [TP_PAD_1.0]
TP1602  I2C0_SDA  [TP_PAD_1.0]
U1600  AT24C512C-SSHD-T  [SOIC8_3.9X4.9_P1.27]
U1601  TMP102AIDRLR  [SOT563-6]

### Nets
GND: C1600.2 C1601.2 H1600.1(MH) H1601.1(MH) H1602.1(MH) H1603.1(MH) LED1600.2(K) LED1601.2(K) LED1602.2(K) LED1603.2(K) R1601.2 R1602.2 U1600.2(A1) U1600.3(A2) U1600.4(GND) U1601.2(GND) U1601.4(ADD0)
VCC_3V3_SYS: C1600.1 C1601.1 R1600.1 R1603.1 R1604.1 R1605.1 R1606.1 R1607.1 U1600.8(VCC) U1601.5(V+)
VCC_5V0: R1610.1
EEPROM_A0: R1600.2 R1601.1 U1600.1(A0)
EEPROM_WP: R1602.1 R1603.2 U1600.7(WP)
I2C0_SCL: R1620.1
I2C0_SCL_BUS: R1605.2 R1620.2 TP1601.1(TP) U1600.6(SCL) U1601.1(SCL)
I2C0_SDA: R1621.1
I2C0_SDA_BUS: R1606.2 R1621.2 TP1602.1(TP) U1600.5(SDA) U1601.6(SDA)
LED_5V_A: LED1603.1(A) R1610.2
LED_PWR_A: LED1600.1(A) R1607.2
LED_USR1_A: LED1601.1(A) R1608.2
LED_USR2_A: LED1602.1(A) R1609.2
TMP102_ALERT_N: R1604.2 TP1600.1(TP) U1601.3(ALERT)
USER_LED1: R1608.1
USER_LED2: R1609.1

### Notes on the sheet
- * Board ID EEPROM at 0x51 (TI SK board-detect address; Octavo BRK uses 0x50 - R1600/R1601 option).
- * I2C0 pull-ups: the only ones on this bus (PMIC 0x30, PD 0x20/21, TMP102 0x48, EEPROM 0x51).
- * R1620/R1621 47R sit at the SoC ball: AM62x I2C0 is an emulated open-drain LVCMOS pad whose fall time is faster than the I2C spec (AM625 DS p.166, SK p.44).
- * USER_LED1/2 = MCU_GPIO0_0/1 (3.3 V, VDDSHV_MCU), active high; pads are off in reset so LEDs are dark.
- * TMP102: place next to the SiP, away from the PMIC inductors. ALERT to a test point only (no SoC pin allocated).
- * Debug-USB power LED (BOM 'Misc', green 330R) belongs on sheet 15 with its rail.
- * Mounting holes M2.5, plated, tied to GND, on the Raspberry Pi pattern (confirm in layout). Fiducials (3, copper only) need no symbol.

### Library data of the parts
C1600 = CAP: Capacitor, non-polarized; Spec: 100nF 16V X7R 0402 (U1600 VCC)
C1601 = CAP: Capacitor, non-polarized; Spec: 10nF 50V X7R 0402 (U1601 V+, DS 7.3)
H1600-H1603 = MOUNTING_HOLE: Plated mounting hole (pin to GND)
LED1600 = LED: LED (pin 1 = anode); Manufacturer: Hubei KENTO; Spec: KT-0805G green (3V3); MPN: KT-0805G
LED1601 = LED: LED (pin 1 = anode); Manufacturer: Hubei KENTO; Spec: KT-0805G green (USER_LED1 heartbeat); MPN: KT-0805G
LED1602 = LED: LED (pin 1 = anode); Manufacturer: Hubei KENTO; Spec: KT-0603R red (USER_LED2); MPN: KT-0603R
LED1603 = LED: LED (pin 1 = anode); Manufacturer: Hubei KENTO; Spec: KT-0603R red (VCC_5V0); MPN: KT-0603R
R1600 = RES: Resistor; Spec: 10k 1% 0402 (A0 = 1 -> 0x51)
R1601 = RES: Resistor; DNP: 1; Spec: 10k 1% 0402 DNP (fit instead of R1600 for 0x50)
R1602 = RES: Resistor; Spec: 10k 1% 0402 (WP low = writable, as SK)
R1603 = RES: Resistor; DNP: 1; Spec: 10k 1% 0402 DNP (write-protect: fit instead of R1602)
R1604 = RES: Resistor; Spec: 10k 1% 0402 (ALERT open drain)
R1605 = RES: Resistor; Spec: 2.2k 1% 0402 (I2C0 SCL pull-up)
R1606 = RES: Resistor; Spec: 2.2k 1% 0402 (I2C0 SDA pull-up)
R1607 = RES: Resistor; Spec: 330R 1% 0402 (power LED)
R1608 = RES: Resistor; Spec: 330R 1% 0402 (heartbeat, ~1.5 mA)
R1609 = RES: Resistor; Spec: 1k 1% 0402 (user 2, ~1.3 mA)
R1610 = RES: Resistor; Spec: 1k 1% 0402 (5 V present, ~3 mA)
R1620 R1621 = RES: Resistor; Spec: 47R 1% 0402 (series at the SoC ball, SK p.44)
TP1600-TP1602 = TESTPOINT: Test point
U1600 = AT24C512C_SOIC8: 512 Kbit I2C EEPROM, SOIC-8 (SSHD: 2.5-5.5 V); Manufacturer: Microchip; MPN: AT24C512C-SSHD-T
U1601 = TMP102_DRL: TMP102 digital temperature sensor, I2C, SOT-563; Manufacturer: Texas Instruments; MPN: TMP102AIDRLR

## Nets that join several sheets
GND: 01_Power_Input (66 pins), 02_PMIC (39 pins), 03_SiP_Power (41 pins), 04_SiP_GND_NC (104 pins), 05_SiP_IO (U1.G2), 06_Clock_Reset_Boot (39 pins), 07_Storage (74 pins), 08_Ethernet (41 pins), 09_USB (38 pins), 10_HDMI (48 pins), 11_Audio (30 pins), 12_Camera (9 pins), 13_Wireless (22 pins), 14_Expansion (20 pins), 15_Debug (66 pins), 16_Misc (17 pins)
VBUS_USBC: 01_Power_Input (13 pins), 09_USB (R902.1)
VCC_3V3_MAIN: 01_Power_Input (14 pins), 02_PMIC (23 pins), 03_SiP_Power (TP302.1)
VCC_3V3_SYS: 01_Power_Input (R108.1), 02_PMIC (10 pins), 03_SiP_Power (13 pins), 06_Clock_Reset_Boot (23 pins), 07_Storage (9 pins), 08_Ethernet (15 pins), 09_USB (11 pins), 10_HDMI (13 pins), 11_Audio (10 pins), 12_Camera (C1203.1 FB1200.1 R1200.1 R1201.1), 13_Wireless (9 pins), 14_Expansion (12 pins), 15_Debug (19 pins), 16_Misc (10 pins)
VCC_5V0: 01_Power_Input (8 pins), 03_SiP_Power (R301.1 TP301.1), 09_USB (7 pins), 10_HDMI (C1017.1 C1018.1 U1001.11), 14_Expansion (F1400.1), 16_Misc (R1610.1)
VDD_1V0_PHY: 02_PMIC (C228.1 U203.5), 03_SiP_Power (TP312.1), 08_Ethernet (14 pins)
VDD_1V8: 02_PMIC (9 pins), 03_SiP_Power (8 pins), 07_Storage (17 pins), 11_Audio (C1109.1 C1110.1 U1100.32), 13_Wireless (12 pins)
VDD_CORE_0V85: 02_PMIC (C210.1 C211.1 L200.2 U200.1), 03_SiP_Power (44 pins)
VDDSHV5_SD: 03_SiP_Power (TP311.1 U1.G21 U1.G22), 07_Storage (8 pins)
VPP_EFUSE_1V8: 02_PMIC (C226.1 U202.5), 03_SiP_Power (C358.1 C359.1 C360.1 U1.C16)
VSYS_PD: 01_Power_Input (17 pins), 03_SiP_Power (TP300.1)
AUD_BCLK: 05_SiP_IO (U1.J26), 11_Audio (R1109.1 U1100.2)
AUD_DIN: 05_SiP_IO (U1.H25), 11_Audio (R1112.1 U1100.5)
AUD_DOUT: 05_SiP_IO (U1.J25), 11_Audio (R1111.1 U1100.4)
AUD_FSYNC: 05_SiP_IO (U1.L25), 11_Audio (R1110.1 U1100.3)
AUD_MCLK: 05_SiP_IO (U1.G26), 11_Audio (R1104.2 R1107.1 U1100.1)
AUD_RST_N: 05_SiP_IO (U1.T25), 11_Audio (R1108.1 U1100.31)
BOOTMODE00: 05_SiP_IO (U1.G28), 06_Clock_Reset_Boot (R620.2 R621.1)
BOOTMODE01: 05_SiP_IO (U1.G27), 06_Clock_Reset_Boot (R622.2 R623.1)
BOOTMODE02: 05_SiP_IO (U1.F28), 06_Clock_Reset_Boot (R624.2 R625.1)
BOOTMODE03: 05_SiP_IO (U1.F27), 06_Clock_Reset_Boot (R644.2 R645.1)
BOOTMODE04: 05_SiP_IO (U1.E28), 06_Clock_Reset_Boot (R646.2 R647.1)
BOOTMODE05: 05_SiP_IO (U1.E27), 06_Clock_Reset_Boot (R648.2 R649.1)
BOOTMODE06: 05_SiP_IO (U1.D28), 06_Clock_Reset_Boot (R650.2 R651.2)
BOOTMODE07: 05_SiP_IO (U1.D27), 06_Clock_Reset_Boot (R626.2 R627.1)
BT_EN: 05_SiP_IO (U1.C25), 13_Wireless (J1300.54 R1315.1)
BT_UART_CTS_N: 05_SiP_IO (U1.C28), 13_Wireless (J1300.34 R1323.2)
BT_UART_RTS_N: 05_SiP_IO (U1.C27), 13_Wireless (J1300.36)
BT_UART_RXD: 05_SiP_IO (U1.B26), 13_Wireless (J1300.22 R1322.2)
BT_UART_TXD: 05_SiP_IO (U1.B27), 13_Wireless (R1316.1)
CAM_I2C_SCL: 05_SiP_IO (U1.E26), 12_Camera (J1200.13 R1200.2)
CAM_I2C_SDA: 05_SiP_IO (U1.E25), 12_Camera (J1200.14 R1201.2)
CAM_IO0: 05_SiP_IO (U1.R24), 12_Camera (J1200.11 R1202.1)
CSI_CLK_N: 05_SiP_IO (U1.V17), 12_Camera (J1200.8)
CSI_CLK_P: 05_SiP_IO (U1.U17), 12_Camera (J1200.9)
CSI_D0_N: 05_SiP_IO (U1.V16), 12_Camera (J1200.2)
CSI_D0_P: 05_SiP_IO (U1.U16), 12_Camera (J1200.3)
CSI_D1_N: 05_SiP_IO (U1.V15), 12_Camera (J1200.5)
CSI_D1_P: 05_SiP_IO (U1.U15), 12_Camera (J1200.6)
DBG_MAIN_UART0_RXD: 05_SiP_IO (U1.A10), 15_Debug (R1511.2 U1504.13)
DBG_MAIN_UART0_TXD: 05_SiP_IO (U1.B10), 15_Debug (R1512.2 U1504.11)
DBG_MAIN_UART1_RXD: 05_SiP_IO (U1.A19), 15_Debug (R1513.2 U1504.12)
DBG_MAIN_UART1_TXD: 05_SiP_IO (U1.B19), 15_Debug (R1514.2 U1504.10)
DBG_MCU_UART0_RXD: 05_SiP_IO (U1.B2), 15_Debug (R1515.2 U1505.13)
DBG_MCU_UART0_TXD: 05_SiP_IO (U1.B3), 15_Debug (R1516.2 U1505.11)
DBG_WKUP_UART0_RXD: 05_SiP_IO (U1.C2), 15_Debug (R1517.2 U1505.12)
DBG_WKUP_UART0_TXD: 05_SiP_IO (U1.C1), 15_Debug (R1518.2 U1505.10)
DDR4_VPP_2V5: 02_PMIC (C219.1 U200.23), 03_SiP_Power (FB302.1), 08_Ethernet (FB800.1)
DPI_D0: 05_SiP_IO (U1.P26), 10_HDMI (U1000.63)
DPI_D1: 05_SiP_IO (U1.N25), 10_HDMI (U1000.62)
DPI_D2: 05_SiP_IO (U1.N26), 10_HDMI (U1000.61)
DPI_D3: 05_SiP_IO (U1.M25), 10_HDMI (U1000.60)
DPI_D4: 05_SiP_IO (U1.M26), 10_HDMI (U1000.59)
DPI_D5: 05_SiP_IO (U1.U27), 10_HDMI (U1000.58)
DPI_D6: 05_SiP_IO (U1.T27), 10_HDMI (U1000.55)
DPI_D7: 05_SiP_IO (U1.T28), 10_HDMI (U1000.54)
DPI_D8: 05_SiP_IO (U1.R27), 10_HDMI (U1000.53)
DPI_D9: 05_SiP_IO (U1.R28), 10_HDMI (U1000.52)
DPI_D10: 05_SiP_IO (U1.P27), 10_HDMI (U1000.51)
DPI_D11: 05_SiP_IO (U1.P28), 10_HDMI (U1000.50)
DPI_D12: 05_SiP_IO (U1.N27), 10_HDMI (U1000.47)
DPI_D13: 05_SiP_IO (U1.N28), 10_HDMI (U1000.46)
DPI_D14: 05_SiP_IO (U1.M27), 10_HDMI (U1000.45)
DPI_D15: 05_SiP_IO (U1.M28), 10_HDMI (U1000.44)
DPI_D16: 05_SiP_IO (U1.L27), 06_Clock_Reset_Boot (R628.2 R629.1), 10_HDMI (U1000.43)
DPI_D17: 05_SiP_IO (U1.L28), 06_Clock_Reset_Boot (R630.2 R631.1), 10_HDMI (U1000.42)
DPI_D18: 05_SiP_IO (U1.K27), 06_Clock_Reset_Boot (R632.2 R633.1), 10_HDMI (U1000.41)
DPI_D19: 05_SiP_IO (U1.K28), 06_Clock_Reset_Boot (R634.2 R635.1), 10_HDMI (U1000.40)
DPI_D20: 05_SiP_IO (U1.J28), 06_Clock_Reset_Boot (R636.2 R637.1), 10_HDMI (U1000.39)
DPI_D21: 05_SiP_IO (U1.J27), 06_Clock_Reset_Boot (R638.2 R639.1), 10_HDMI (U1000.38)
DPI_D22: 05_SiP_IO (U1.H28), 06_Clock_Reset_Boot (R640.2 R641.1), 10_HDMI (U1000.37)
DPI_D23: 05_SiP_IO (U1.H27), 06_Clock_Reset_Boot (R642.2 R643.1), 10_HDMI (U1000.36)
DPI_DE: 05_SiP_IO (U1.R25), 10_HDMI (U1000.2)
DPI_HSYNC: 05_SiP_IO (U1.P25), 10_HDMI (U1000.4)
DPI_PCLK: 05_SiP_IO (U1.T26), 10_HDMI (R1000.1)
DPI_VSYNC: 05_SiP_IO (U1.R26), 10_HDMI (U1000.5)
EMMC_CLK: 05_SiP_IO (U1.J1), 07_Storage (R700.1)
EMMC_CMD: 05_SiP_IO (U1.K1), 07_Storage (J700.25 R701.2)
EMMC_D0: 05_SiP_IO (U1.K2), 07_Storage (J700.6 R702.2)
EMMC_D1: 05_SiP_IO (U1.L1), 07_Storage (J700.29 R703.2)
EMMC_D2: 05_SiP_IO (U1.L2), 07_Storage (J700.27 R704.2)
EMMC_D3: 05_SiP_IO (U1.M1), 07_Storage (J700.10 R705.2)
EMMC_D4: 05_SiP_IO (U1.M2), 07_Storage (J700.4 R706.2)
EMMC_D5: 05_SiP_IO (U1.N1), 07_Storage (J700.2 R707.2)
EMMC_D6: 05_SiP_IO (U1.N2), 07_Storage (J700.33 R708.2)
EMMC_D7: 05_SiP_IO (U1.P1), 07_Storage (J700.31 R709.2)
EMMC_RST_N: 05_SiP_IO (U1.D25), 07_Storage (R710.2 U703.1)
EMU0: 05_SiP_IO (U1.D8), 15_Debug (J1501.13 R1526.2 U1511.2 U1511.9)
EMU1: 05_SiP_IO (U1.C8), 15_Debug (J1501.14 R1527.2 U1511.4 U1511.7)
ETH_MDC: 05_SiP_IO (U1.V26), 08_Ethernet (U800.16)
ETH_MDIO: 05_SiP_IO (U1.U26), 08_Ethernet (R813.2 U800.17)
ETH_PHY_INT_N: 05_SiP_IO (U1.T20), 08_Ethernet (R814.2 U800.44)
ETH_PHY_RST_N: 05_SiP_IO (U1.R19), 08_Ethernet (R815.2 U800.43)
ETH_RD0: 05_SiP_IO (U1.U22), 08_Ethernet (R808.2)
ETH_RD1: 05_SiP_IO (U1.V22), 08_Ethernet (R809.2)
ETH_RD2: 05_SiP_IO (U1.U21), 08_Ethernet (R810.2)
ETH_RD3: 05_SiP_IO (U1.V21), 08_Ethernet (R811.2)
ETH_RX_CTL: 05_SiP_IO (U1.V20), 08_Ethernet (R807.2)
ETH_RXC: 05_SiP_IO (U1.U20), 08_Ethernet (R806.2)
ETH_TD0: 05_SiP_IO (U1.U25), 08_Ethernet (R802.1)
ETH_TD1: 05_SiP_IO (U1.V25), 08_Ethernet (R803.1)
ETH_TD2: 05_SiP_IO (U1.U24), 08_Ethernet (R804.1)
ETH_TD3: 05_SiP_IO (U1.V24), 08_Ethernet (R805.1)
ETH_TX_CTL: 05_SiP_IO (U1.V23), 08_Ethernet (R801.1)
ETH_TXC: 05_SiP_IO (U1.U23), 08_Ethernet (R800.1)
HDMI_CT_CP_HPD: 05_SiP_IO (U1.R20), 10_HDMI (R1009.1 U1001.12)
HDMI_HPD: 05_SiP_IO (U1.R21), 10_HDMI (R1011.1 U1001.4)
HDMI_LS_OE: 05_SiP_IO (U1.T21), 10_HDMI (R1010.1 U1001.5)
HDMI_PD_N: 05_SiP_IO (U1.T22), 10_HDMI (R1006.1 U1000.10)
HDR3_I2C1_SDA: 05_SiP_IO (U1.B7), 14_Expansion (C1400.1 R1424.1)
HDR5_I2C1_SCL: 05_SiP_IO (U1.A7), 14_Expansion (C1401.1 R1425.1)
HDR7_GPIO4_GPCLK: 05_SiP_IO (U1.D16), 14_Expansion (R1400.1)
HDR8_UART_TXD: 05_SiP_IO (U1.A11), 14_Expansion (R1412.1)
HDR10_UART_RXD: 05_SiP_IO (U1.B11), 14_Expansion (R1413.1 R1433.2)
HDR11_GPIO17: 05_SiP_IO (U1.G25), 14_Expansion (R1401.1)
HDR12_GPIO18_PCM_CLK: 05_SiP_IO (U1.A18), 14_Expansion (R1414.1)
HDR13_GPIO27: 05_SiP_IO (U1.F25), 14_Expansion (R1402.1)
HDR15_GPIO22: 05_SiP_IO (U1.A9), 14_Expansion (R1403.1)
HDR16_GPIO23: 05_SiP_IO (U1.L26), 14_Expansion (R1415.1)
HDR18_GPIO24: 05_SiP_IO (U1.K26), 14_Expansion (R1416.1)
HDR19_SPI0_MOSI: 05_SiP_IO (U1.D12), 14_Expansion (R1404.1)
HDR21_SPI0_MISO: 05_SiP_IO (U1.C12), 14_Expansion (R1405.1)
HDR22_GPIO25: 05_SiP_IO (U1.B9), 14_Expansion (R1417.1)
HDR23_SPI0_SCLK: 05_SiP_IO (U1.C11), 14_Expansion (R1406.1)
HDR24_SPI0_CE0_N: 05_SiP_IO (U1.D13), 14_Expansion (R1418.1)
HDR26_SPI0_CE1_N: 05_SiP_IO (U1.C13), 14_Expansion (R1419.1)
HDR27_ID_SD: 05_SiP_IO (U1.B8), 14_Expansion (C1402.1 R1426.1)
HDR28_ID_SC: 05_SiP_IO (U1.A8), 14_Expansion (C1403.1 R1427.1)
HDR29_GPIO5: 05_SiP_IO (U1.K25), 14_Expansion (R1407.1)
HDR31_GPIO6: 05_SiP_IO (U1.H26), 14_Expansion (R1408.1)
HDR32_GPIO12_PWM0: 05_SiP_IO (U1.A17), 14_Expansion (R1420.1)
HDR33_GPIO13_PWM1: 05_SiP_IO (U1.B17), 14_Expansion (R1409.1)
HDR35_GPIO19_PCM_FS: 05_SiP_IO (U1.B18), 14_Expansion (R1410.1)
HDR36_GPIO16: 05_SiP_IO (U1.E2), 14_Expansion (R1421.1)
HDR37_GPIO26: 05_SiP_IO (U1.F26), 14_Expansion (R1411.1)
HDR38_GPIO20_PCM_DIN: 05_SiP_IO (U1.A16), 14_Expansion (R1422.1)
HDR40_GPIO21_PCM_DOUT: 05_SiP_IO (U1.B16), 14_Expansion (R1423.1)
I2C0_SCL: 05_SiP_IO (U1.A12), 16_Misc (R1620.1)
I2C0_SCL_BUS: 01_Power_Input (U100.9), 02_PMIC (U200.10), 16_Misc (5 pins)
I2C0_SDA: 05_SiP_IO (U1.B12), 16_Misc (R1621.1)
I2C0_SDA_BUS: 01_Power_Input (U100.8), 02_PMIC (U200.9), 16_Misc (5 pins)
I2C1_SCL: 05_SiP_IO (U1.A13), 10_HDMI (U1001.2), 11_Audio (R1100.2 R1102.1)
I2C1_SDA: 05_SiP_IO (U1.B13), 10_HDMI (U1001.3), 11_Audio (R1101.2 R1103.1)
JTAG_SRST_N: 06_Clock_Reset_Boot (R604.2 U601.3), 15_Debug (5 pins)
JTAG_TCK: 05_SiP_IO (U1.D9), 15_Debug (5 pins)
JTAG_TDI: 05_SiP_IO (U1.D10), 15_Debug (J1501.3 R1525.2 U1510.4 U1510.7)
JTAG_TDO: 05_SiP_IO (U1.D11), 15_Debug (R1520.1)
JTAG_TMS: 05_SiP_IO (U1.C10), 15_Debug (J1501.1 R1524.2 U1510.2 U1510.9)
JTAG_TRSTN: 05_SiP_IO (U1.C9), 15_Debug (J1501.2 R1528.1 U1511.1 U1511.10)
LFOSC_XI: 05_SiP_IO (U1.H1), 06_Clock_Reset_Boot (C602.1 R603.1 Y600.1)
LFOSC_XO: 05_SiP_IO (U1.H2), 06_Clock_Reset_Boot (C603.1 R603.2 Y600.2)
M2_SUSCLK_32K: 05_SiP_IO (U1.C7), 13_Wireless (J1300.50)
MCU_ERRORN: 05_SiP_IO (U1.D7), 06_Clock_Reset_Boot (R613.1 TP605.1)
MCU_PORZ: 05_SiP_IO (U1.D6), 06_Clock_Reset_Boot (C605.1 R606.1 TP601.1 U601.4)
MCU_RESETSTATZ: 05_SiP_IO (U1.C6), 06_Clock_Reset_Boot (TP606.1)
MCU_RESETZ: 05_SiP_IO (U1.C5), 06_Clock_Reset_Boot (R610.2 TP602.1)
OSC_25M: 05_SiP_IO (U1.G1), 06_Clock_Reset_Boot (R600.2)
PD_INT_N: 01_Power_Input (R108.2 U100.6), 05_SiP_IO (U1.F1)
PMIC_LPM_EN0: 02_PMIC (R210.2), 05_SiP_IO (U1.D5)
PMIC_NINT: 02_PMIC (C220.1 R203.2), 05_SiP_IO (U1.C17)
PMIC_PGOOD: 02_PMIC (R201.2 U200.18), 06_Clock_Reset_Boot (U601.1)
PORZ_OUT: 05_SiP_IO (U1.D18), 06_Clock_Reset_Boot (R612.1 TP604.1)
RESET_REQZ: 05_SiP_IO (U1.D17), 06_Clock_Reset_Boot (C609.1 R609.2 U602.6)
RESETSTATZ: 05_SiP_IO (U1.C18), 06_Clock_Reset_Boot (R611.1 TP603.1), 07_Storage (R720.1 U703.2), 08_Ethernet (R815.1)
SD_CD_N: 05_SiP_IO (U1.A23), 07_Storage (R730.2)
SD_CLK: 05_SiP_IO (U1.B21), 07_Storage (5 pins)
SD_CMD: 05_SiP_IO (U1.A21), 07_Storage (J702.3 R723.2 U701.1 U701.10)
SD_D0: 05_SiP_IO (U1.A22), 07_Storage (J702.7 R724.2 U701.4 U701.7)
SD_D1: 05_SiP_IO (U1.B22), 07_Storage (J702.8 R725.2 U701.5 U701.6)
SD_D2: 05_SiP_IO (U1.A20), 07_Storage (J702.1 R726.2 U702.2 U702.9)
SD_D3: 05_SiP_IO (U1.B20), 07_Storage (J702.2 R727.2 U702.1 U702.10)
SD_PWR_EN: 05_SiP_IO (U1.T23), 07_Storage (R720.2 R721.1 R722.1)
SD_VSEL: 02_PMIC (R204.2 U200.12), 05_SiP_IO (U1.B23)
USB0_DM: 05_SiP_IO (U1.U12), 09_USB (L900.3)
USB0_DP: 05_SiP_IO (U1.V12), 09_USB (L900.2)
USB0_DRVVBUS: 05_SiP_IO (U1.C19), 09_USB (R905.1)
USB0_VBUS_DIV: 05_SiP_IO (U1.V11), 09_USB (R903.2 R904.1)
USB1_DM: 05_SiP_IO (U1.U10), 09_USB (U900.20)
USB1_DP: 05_SiP_IO (U1.V10), 09_USB (U900.21)
USB1_DRVVBUS: 05_SiP_IO (U1.D19), 09_USB (R913.1 U901.4 U902.4)
USB1_VBUS_DIV: 05_SiP_IO (U1.U11), 09_USB (R911.2 R912.1)
USB_HUB_RST_N: 05_SiP_IO (U1.R22), 09_USB (D902.2 R906.1)
USBC1_DM: 01_Power_Input (J100.A7 J100.B7), 09_USB (D900.3 L900.4)
USBC1_DP: 01_Power_Input (J100.A6 J100.B6), 09_USB (D900.2 L900.1)
USER_BTN_N: 05_SiP_IO (U1.F2), 06_Clock_Reset_Boot (U602.4)
USER_LED1: 05_SiP_IO (U1.B6), 16_Misc (R1608.1)
USER_LED2: 05_SiP_IO (U1.A6), 16_Misc (R1609.1)
VDD_SDIO_LDO1: 02_PMIC (C216.1 U200.7), 07_Storage (C711.1 U700.3)
VDDA_1V8: 02_PMIC (C218.1 U200.21), 03_SiP_Power (9 pins)
VDDS_DDR_1V2: 02_PMIC (C214.1 C215.1 L202.2 U200.24), 03_SiP_Power (14 pins)
VDDS_OSC0_1V8: 03_SiP_Power (FB310.2 TP310.1 U1.D15), 06_Clock_Reset_Boot (7 pins)
VPP_EFUSE_EN: 02_PMIC (R206.1 U202.3), 05_SiP_IO (U1.A4)
WL_SDIO_CLK: 05_SiP_IO (U1.D23), 13_Wireless (J1300.9 R1310.1)
WL_SDIO_CMD: 05_SiP_IO (U1.C23), 13_Wireless (J1300.11 R1305.2)
WL_SDIO_D0: 05_SiP_IO (U1.D22), 13_Wireless (J1300.13 R1306.2)
WL_SDIO_D1: 05_SiP_IO (U1.C22), 13_Wireless (J1300.15 R1307.2)
WL_SDIO_D2: 05_SiP_IO (U1.D21), 13_Wireless (J1300.17 R1308.2)
WL_SDIO_D3: 05_SiP_IO (U1.C21), 13_Wireless (J1300.19 R1309.2)
WLAN_EN: 05_SiP_IO (U1.D20), 13_Wireless (J1300.23 J1300.56 R1312.1)
WLAN_IRQ: 05_SiP_IO (U1.C20), 13_Wireless (J1300.21 R1311.2)

## Assembly variants
Production: not fitted C225 C226 C358 C359 C360 C802 C831 C913 C1404 J701 J1501 R207 R603 R621 R623 R624 R626 R628 R631 R633 R634 R636 R638 R640 R642 R728 R900 R901 R905 R914 R915 R916 R917 R1012 R1013 R1014 R1015 R1016 R1203 R1314 R1432 R1506 R1529 R1601 R1603 U202 U1400